# Altium project Flight Controller SoM.PrjPcb (part 1 of 2)
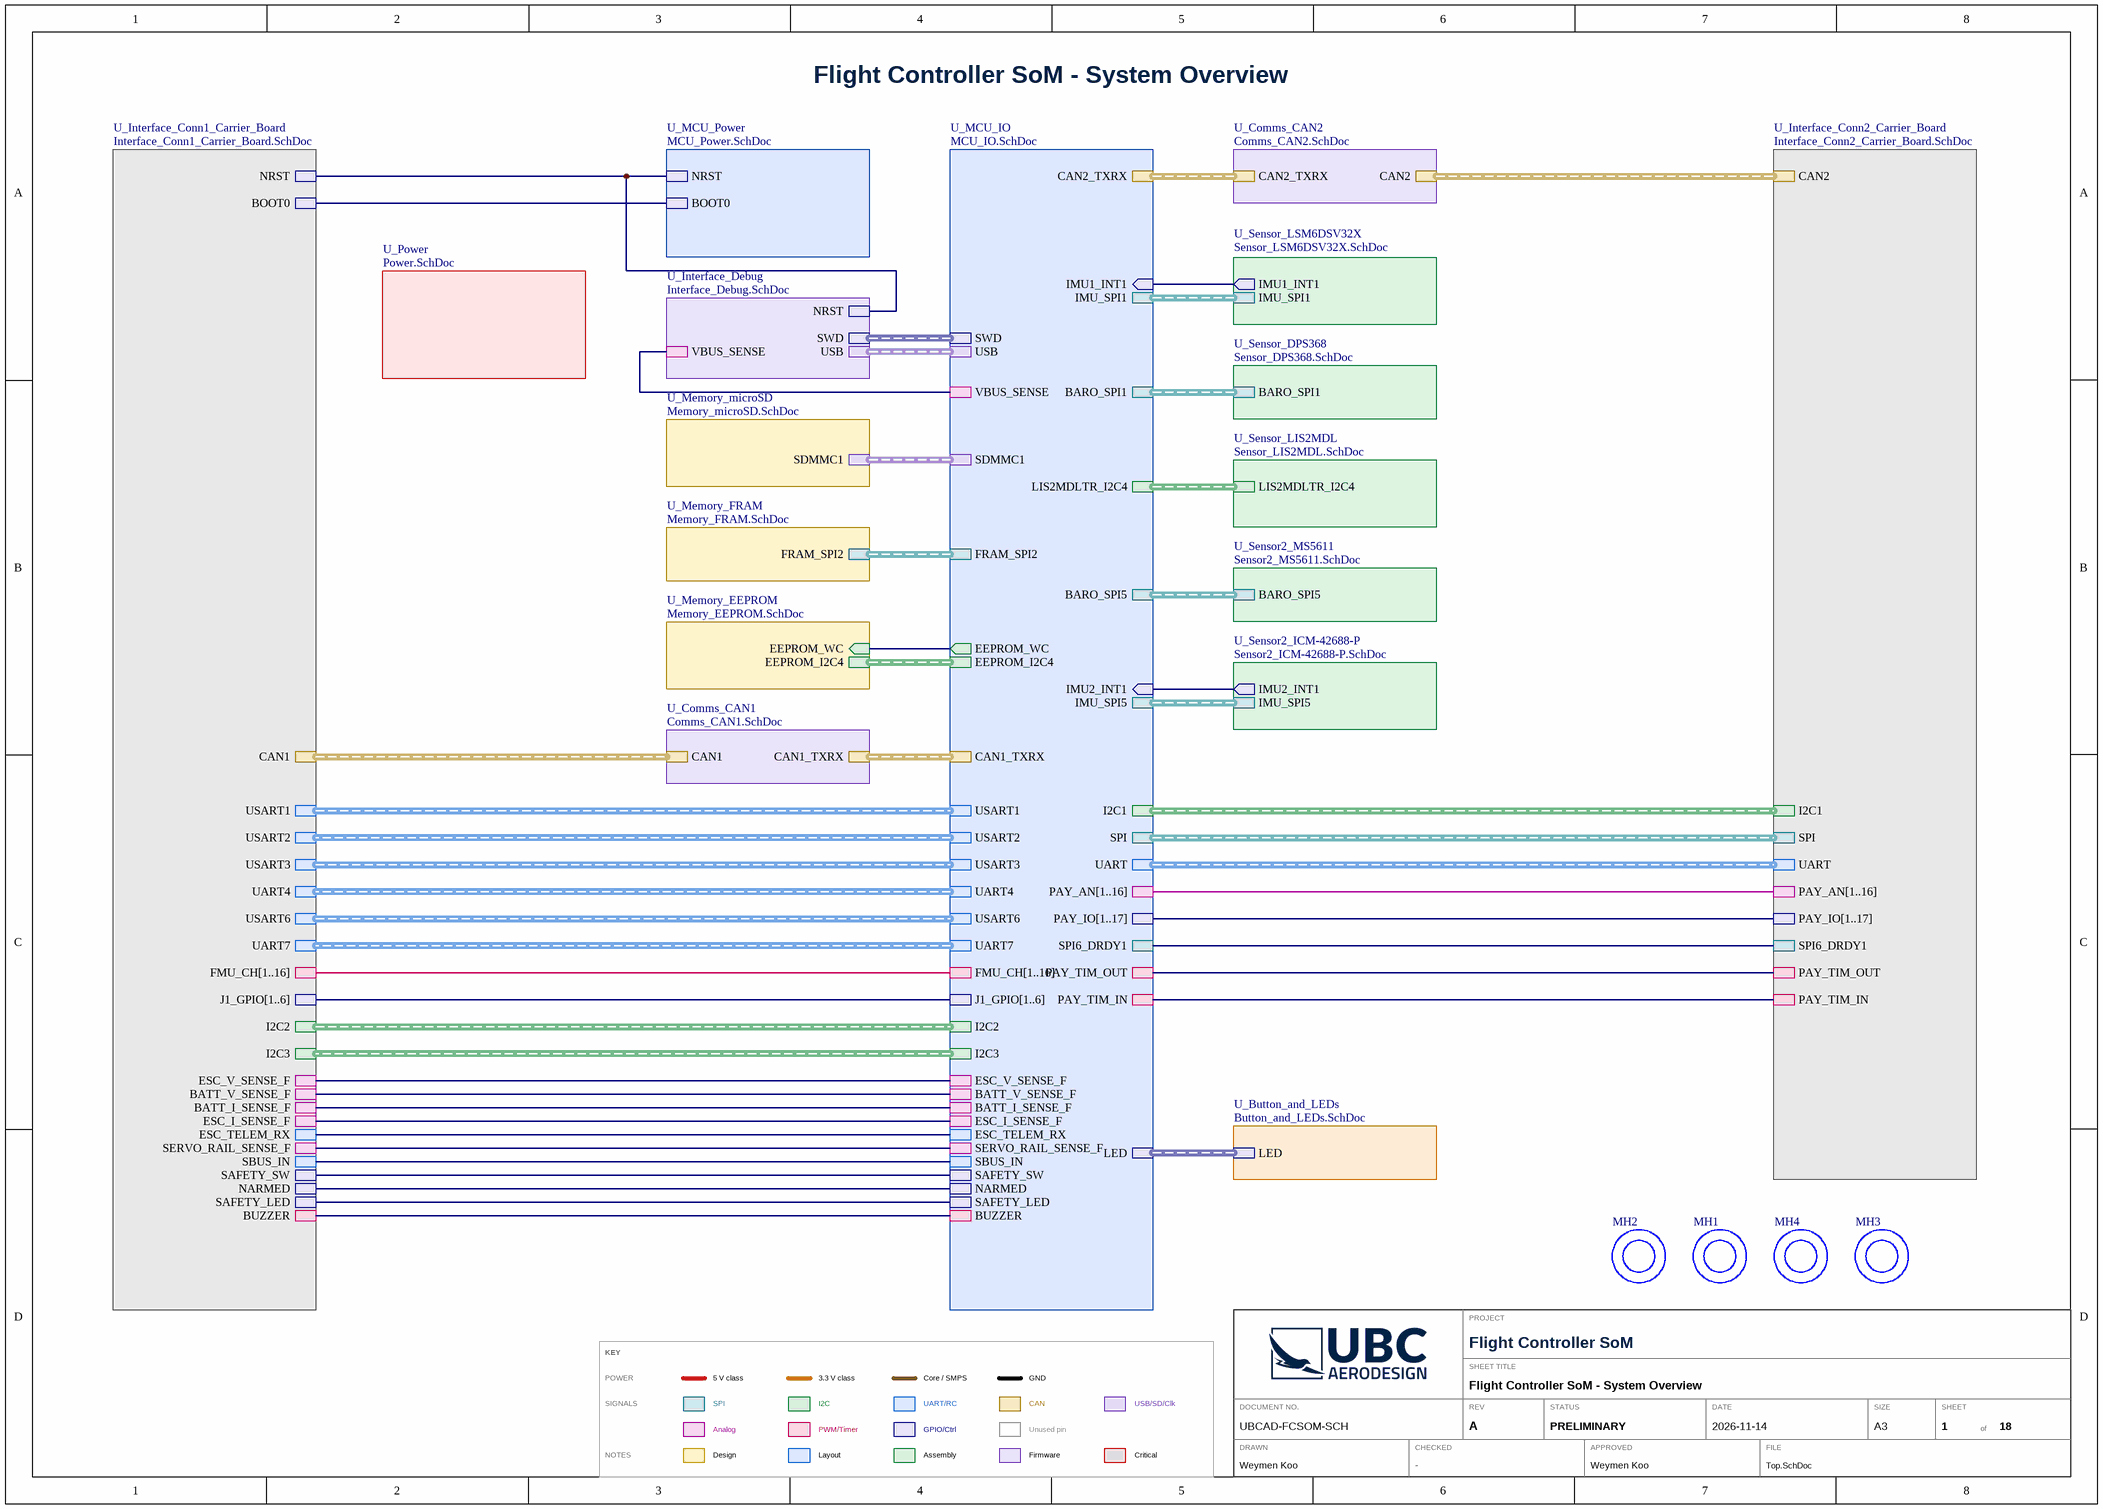
[diagram p0: Top.SchDoc]
18 sheets, 176 parts. Net scope: hierarchical (ports join the sheet entries above them; power ports are global).
Board file: Flight Controller SoM.PcbDoc
Sheets:
  Top.SchDoc
    U_MCU_Power = MCU_Power.SchDoc
    U_Memory_EEPROM = Memory_EEPROM.SchDoc
    U_Memory_FRAM = Memory_FRAM.SchDoc
    U_Memory_microSD = Memory_microSD.SchDoc
    U_Sensor_DPS368 = Sensor_DPS368.SchDoc
    U_Sensor_LSM6DSV32X = Sensor_LSM6DSV32X.SchDoc
    U_Sensor_LIS2MDL = Sensor_LIS2MDL.SchDoc
    U_Sensor2_MS5611 = Sensor2_MS5611.SchDoc
    U_Sensor2_ICM-42688-P = Sensor2_ICM-42688-P.SchDoc
    U_Button_and_LEDs = Button_and_LEDs.SchDoc
    U_Interface_Debug = Interface_Debug.SchDoc
    U_MCU_IO = MCU_IO.SchDoc
    U_Power = Power.SchDoc
    U_Interface_Conn1_Carrier_Board = Interface_Conn1_Carrier_Board.SchDoc
    U_Interface_Conn2_Carrier_Board = Interface_Conn2_Carrier_Board.SchDoc
    U_Comms_CAN1 = Comms_CAN1.SchDoc
    U_Comms_CAN2 = Comms_CAN2.SchDoc

## Sheet Top.SchDoc: Flight Controller SoM - System Overview
size A3; Date: 11/20/2026; ApprovedBy: Weymen Koo; CheckedBy: -; Author: Weymen Koo; CompanyName: UBC AeroDesign; DrawnBy: Weymen Koo; Organization: UBC AeroDesign; DocumentNumber: UBCAD-FCSOM-SCH; Revision: A; SheetNumber: 1; SheetTotal: 18; ProjectTitle: Flight Controller SoM; Status: PRELIMINARY; ReleaseDate: 2026-11-14; FC_IdxN01: 1; FC_IdxT01: System overview; FC_IdxN02: 2; FC_IdxT02: Power; FC_IdxN03: 3; FC_IdxT03: MCU power, clock, reset; FC_IdxN04: 4; FC_IdxT04: MCU I/O; FC_IdxN05: 5; FC_IdxT05: IMU 1 LSM6DSV32X; FC_IdxN06: 6; FC_IdxT06: Baro 1 DPS368; FC_IdxN07: 7; FC_IdxT07: IMU 2 ICM-42688-P; FC_IdxN08: 8; FC_IdxT08: Baro 2 MS5611; FC_IdxN09: 9; FC_IdxT09: Mag LIS2MDL; FC_IdxN10: 10; FC_IdxT10: FRAM; FC_IdxN11: 11; FC_IdxT11: EEPROM; FC_IdxN12: 12; FC_IdxT12: microSD; FC_IdxN13: 13; FC_IdxT13: CAN FD 1; FC_IdxN14: 14; FC_IdxT14: CAN FD 2; FC_IdxN15: 15; FC_IdxT15: USB-C, SWD debug; FC_IdxN16: 16; FC_IdxT16: Status LEDs; FC_IdxN17: 17; FC_IdxT17: Carrier J4 flight I/O; FC_IdxN18: 18; FC_IdxT18: Carrier J5 payload I/O; FC_Rev1: A; FC_RevDate1: 2026-11-14; FC_RevDesc1: First release, JLCPCB fab and assembly; FC_RevBy1: Weymen Koo

### Parts
MH1  MH_M3_NPTH_3.2_MO6.0_KO6.5  [MH_M3_NPTH_7mmKO-Footprint-1]  (value not drawn)  (no BOM)
MH2  MH_M3_NPTH_3.2_MO6.0_KO6.5  [MH_M3_NPTH_7mmKO-Footprint-1]  (value not drawn)  (no BOM)
MH3  MH_M3_NPTH_3.2_MO6.0_KO6.5  [MH_M3_NPTH_7mmKO-Footprint-1]  (value not drawn)  (no BOM)
MH4  MH_M3_NPTH_3.2_MO6.0_KO6.5  [MH_M3_NPTH_7mmKO-Footprint-1]  (value not drawn)  (no BOM)

### Sub-sheets
U_Button_and_LEDs = Button_and_LEDs.SchDoc: LED (harness LED)
U_Comms_CAN1 = Comms_CAN1.SchDoc: CAN1 (harness CAN), CAN1_TXRX (harness TXD)
U_Comms_CAN2 = Comms_CAN2.SchDoc: CAN2 (harness CAN), CAN2_TXRX (harness TXD)
U_Interface_Conn1_Carrier_Board = Interface_Conn1_Carrier_Board.SchDoc: USART1 (harness UART), USART2 (harness UART), USART3 (harness UART), UART4 (harness UART), USART6 (harness UART), UART7 (harness UART), CAN1 (harness CAN), FMU_CH[1..16], J1_GPIO[1..6], ESC_I_SENSE_F, ESC_TELEM_RX, I2C2 (harness I2C), I2C3 (harness I2C), NRST, BATT_V_SENSE_F, BATT_I_SENSE_F, SERVO_RAIL_SENSE_F, SBUS_IN, SAFETY_SW, NARMED, SAFETY_LED, BUZZER, BOOT0, ESC_V_SENSE_F
U_Interface_Conn2_Carrier_Board = Interface_Conn2_Carrier_Board.SchDoc: CAN2 (harness CAN), UART (harness UART), SPI (harness SPI), I2C1 (harness I2C), SPI6_DRDY1, PAY_AN[1..16], PAY_IO[1..17], PAY_TIM_OUT, PAY_TIM_IN
U_Interface_Debug = Interface_Debug.SchDoc: USB (harness USB), SWD (harness SWD), NRST, VBUS_SENSE
U_MCU_IO = MCU_IO.SchDoc: USART1 (harness UART), USART2 (harness UART), USART3 (harness UART), UART4 (harness UART), USART6 (harness UART), UART7 (harness UART), CAN1_TXRX (harness TXD), EEPROM_I2C4 (harness I2C), EEPROM_WC (out), FRAM_SPI2 (harness SPI), SDMMC1 (harness SDMMC), IMU2_INT1 (in), IMU_SPI5 (harness SPI), IMU1_INT1 (in), IMU_SPI1 (harness SPI), CAN2_TXRX (harness TXD), BARO_SPI5 (harness SPI), BARO_SPI1 (harness SPI), I2C1 (harness I2C), SPI (harness SPI), UART (harness UART), SPI6_DRDY1, FMU_CH[1..16], J1_GPIO[1..6], PAY_AN[1..16], PAY_IO[1..17], USB (harness USB), SWD (harness SWD), ESC_I_SENSE_F, ESC_TELEM_RX, I2C2 (harness I2C), I2C3 (harness I2C), BATT_V_SENSE_F, BATT_I_SENSE_F, SERVO_RAIL_SENSE_F, SBUS_IN, SAFETY_SW, NARMED, SAFETY_LED, BUZZER, PAY_TIM_OUT, PAY_TIM_IN, ESC_V_SENSE_F, LIS2MDLTR_I2C4 (harness I2C), VBUS_SENSE, LED (harness LED)
U_MCU_Power = MCU_Power.SchDoc: NRST, BOOT0
U_Memory_EEPROM = Memory_EEPROM.SchDoc: EEPROM_WC (in), EEPROM_I2C4 (harness I2C)
U_Memory_FRAM = Memory_FRAM.SchDoc: FRAM_SPI2 (harness SPI)
U_Memory_microSD = Memory_microSD.SchDoc: SDMMC1 (harness SDMMC)
U_Power = Power.SchDoc: no entries
U_Sensor2_ICM-42688-P = Sensor2_ICM-42688-P.SchDoc: IMU2_INT1 (out), IMU_SPI5 (harness SPI)
U_Sensor2_MS5611 = Sensor2_MS5611.SchDoc: BARO_SPI5 (harness SPI)
U_Sensor_DPS368 = Sensor_DPS368.SchDoc: BARO_SPI1 (harness SPI)
U_Sensor_LIS2MDL = Sensor_LIS2MDL.SchDoc: LIS2MDLTR_I2C4 (harness I2C)
U_Sensor_LSM6DSV32X = Sensor_LSM6DSV32X.SchDoc: IMU1_INT1 (out), IMU_SPI1 (harness SPI)

### Nets
BATT_I_SENSE_F: sheet U_MCU_IO/BATT_I_SENSE_F, sheet U_Interface_Conn1_Carrier_Board/BATT_I_SENSE_F
BATT_V_SENSE_F: sheet U_MCU_IO/BATT_V_SENSE_F, sheet U_Interface_Conn1_Carrier_Board/BATT_V_SENSE_F
BOOT0: sheet U_MCU_Power/BOOT0, sheet U_Interface_Conn1_Carrier_Board/BOOT0
BUZZER: sheet U_MCU_IO/BUZZER, sheet U_Interface_Conn1_Carrier_Board/BUZZER
EEPROM_WC: sheet U_Memory_EEPROM/EEPROM_WC, sheet U_MCU_IO/EEPROM_WC
ESC_I_SENSE_F: sheet U_MCU_IO/ESC_I_SENSE_F, sheet U_Interface_Conn1_Carrier_Board/ESC_I_SENSE_F
ESC_TELEM_RX: sheet U_MCU_IO/ESC_TELEM_RX, sheet U_Interface_Conn1_Carrier_Board/ESC_TELEM_RX
ESC_V_SENSE_F: sheet U_MCU_IO/ESC_V_SENSE_F, sheet U_Interface_Conn1_Carrier_Board/ESC_V_SENSE_F
IMU1_INT1: sheet U_Sensor_LSM6DSV32X/IMU1_INT1, sheet U_MCU_IO/IMU1_INT1
IMU2_INT1: sheet U_Sensor2_ICM-42688-P/IMU2_INT1, sheet U_MCU_IO/IMU2_INT1
NARMED: sheet U_MCU_IO/NARMED, sheet U_Interface_Conn1_Carrier_Board/NARMED
NRST: sheet U_MCU_Power/NRST, sheet U_Interface_Debug/NRST, sheet U_Interface_Conn1_Carrier_Board/NRST
PAY_TIM_IN: sheet U_MCU_IO/PAY_TIM_IN, sheet U_Interface_Conn2_Carrier_Board/PAY_TIM_IN
PAY_TIM_OUT: sheet U_MCU_IO/PAY_TIM_OUT, sheet U_Interface_Conn2_Carrier_Board/PAY_TIM_OUT
SAFETY_LED: sheet U_MCU_IO/SAFETY_LED, sheet U_Interface_Conn1_Carrier_Board/SAFETY_LED
SAFETY_SW: sheet U_MCU_IO/SAFETY_SW, sheet U_Interface_Conn1_Carrier_Board/SAFETY_SW
SBUS_IN: sheet U_MCU_IO/SBUS_IN, sheet U_Interface_Conn1_Carrier_Board/SBUS_IN
SERVO_RAIL_SENSE_F: sheet U_MCU_IO/SERVO_RAIL_SENSE_F, sheet U_Interface_Conn1_Carrier_Board/SERVO_RAIL_SENSE_F
SPI6_DRDY1: sheet U_MCU_IO/SPI6_DRDY1, sheet U_Interface_Conn2_Carrier_Board/SPI6_DRDY1
VBUS_SENSE: sheet U_Interface_Debug/VBUS_SENSE, sheet U_MCU_IO/VBUS_SENSE

### Buses and harness runs
bus sheet U_Interface_Conn1_Carrier_Board/FMU_CH[1..16] = sheet U_MCU_IO/FMU_CH[1..16]
bus sheet U_Interface_Conn1_Carrier_Board/J1_GPIO[1..6] = sheet U_MCU_IO/J1_GPIO[1..6]
bus sheet U_Interface_Conn2_Carrier_Board/PAY_AN[1..16] = sheet U_MCU_IO/PAY_AN[1..16]
bus sheet U_Interface_Conn2_Carrier_Board/PAY_IO[1..17] = sheet U_MCU_IO/PAY_IO[1..17]
harness sheet U_Button_and_LEDs/LED = sheet U_MCU_IO/LED
harness sheet U_Comms_CAN1/CAN1 = sheet U_Interface_Conn1_Carrier_Board/CAN1
harness sheet U_Comms_CAN1/CAN1_TXRX = sheet U_MCU_IO/CAN1_TXRX
harness sheet U_Comms_CAN2/CAN2 = sheet U_Interface_Conn2_Carrier_Board/CAN2
harness sheet U_Comms_CAN2/CAN2_TXRX = sheet U_MCU_IO/CAN2_TXRX
harness sheet U_Interface_Conn1_Carrier_Board/I2C2 = sheet U_MCU_IO/I2C2
harness sheet U_Interface_Conn1_Carrier_Board/I2C3 = sheet U_MCU_IO/I2C3
harness sheet U_Interface_Conn1_Carrier_Board/UART4 = sheet U_MCU_IO/UART4
harness sheet U_Interface_Conn1_Carrier_Board/UART7 = sheet U_MCU_IO/UART7
harness sheet U_Interface_Conn1_Carrier_Board/USART1 = sheet U_MCU_IO/USART1
harness sheet U_Interface_Conn1_Carrier_Board/USART2 = sheet U_MCU_IO/USART2
harness sheet U_Interface_Conn1_Carrier_Board/USART3 = sheet U_MCU_IO/USART3
harness sheet U_Interface_Conn1_Carrier_Board/USART6 = sheet U_MCU_IO/USART6
harness sheet U_Interface_Conn2_Carrier_Board/I2C1 = sheet U_MCU_IO/I2C1
harness sheet U_Interface_Conn2_Carrier_Board/SPI = sheet U_MCU_IO/SPI
harness sheet U_Interface_Conn2_Carrier_Board/UART = sheet U_MCU_IO/UART
harness sheet U_Interface_Debug/SWD = sheet U_MCU_IO/SWD
harness sheet U_Interface_Debug/USB = sheet U_MCU_IO/USB
harness sheet U_MCU_IO/BARO_SPI1 = sheet U_Sensor_DPS368/BARO_SPI1
harness sheet U_MCU_IO/BARO_SPI5 = sheet U_Sensor2_MS5611/BARO_SPI5
harness sheet U_MCU_IO/EEPROM_I2C4 = sheet U_Memory_EEPROM/EEPROM_I2C4
harness sheet U_MCU_IO/FRAM_SPI2 = sheet U_Memory_FRAM/FRAM_SPI2
harness sheet U_MCU_IO/IMU_SPI1 = sheet U_Sensor_LSM6DSV32X/IMU_SPI1
harness sheet U_MCU_IO/IMU_SPI5 = sheet U_Sensor2_ICM-42688-P/IMU_SPI5
harness sheet U_MCU_IO/LIS2MDLTR_I2C4 = sheet U_Sensor_LIS2MDL/LIS2MDLTR_I2C4
harness sheet U_MCU_IO/SDMMC1 = sheet U_Memory_microSD/SDMMC1

### Notes on the sheet
- PROJECT
- KEY
- POWER
- 5 V class
- 3.3 V class
- Core / SMPS
- GND
- SHEET TITLE
- SIGNALS
- NOTES
- SPI
- Analog
- Design
- I2C
- PWM/Timer
- Layout
- UART/RC
- GPIO/Ctrl
- Assembly
- CAN
- Unused pin
- Firmware
- USB/SD/Clk
- Critical
- DRAWN
- DOCUMENT NO.
- CHECKED
- REV
- STATUS
- APPROVED
- DATE
- FILE
- SIZE
- A3
- SHEET
- of

### Library data of the parts
MH1-MH4 = CMP-00043-8: Mounting hole, M3, non-plated, Ø3.2 mm finished hole, Ø6.0 mm solder mask opening (bare FR-4), Ø6.2 mm copper keepout all layers, electrically isolated

## Sheet MCU_Power.SchDoc: MCU - Power, SMPS, Clock, Reset, Boot
size A3; ApprovedBy: Weymen Koo; CheckedBy: -; DrawnBy: Weymen Koo; DocumentNumber: UBCAD-FCSOM-SCH; Revision: A; SheetNumber: 4; SheetTotal: 18; ProjectTitle: Flight Controller SoM; Status: PRELIMINARY; ReleaseDate: 2026-11-14
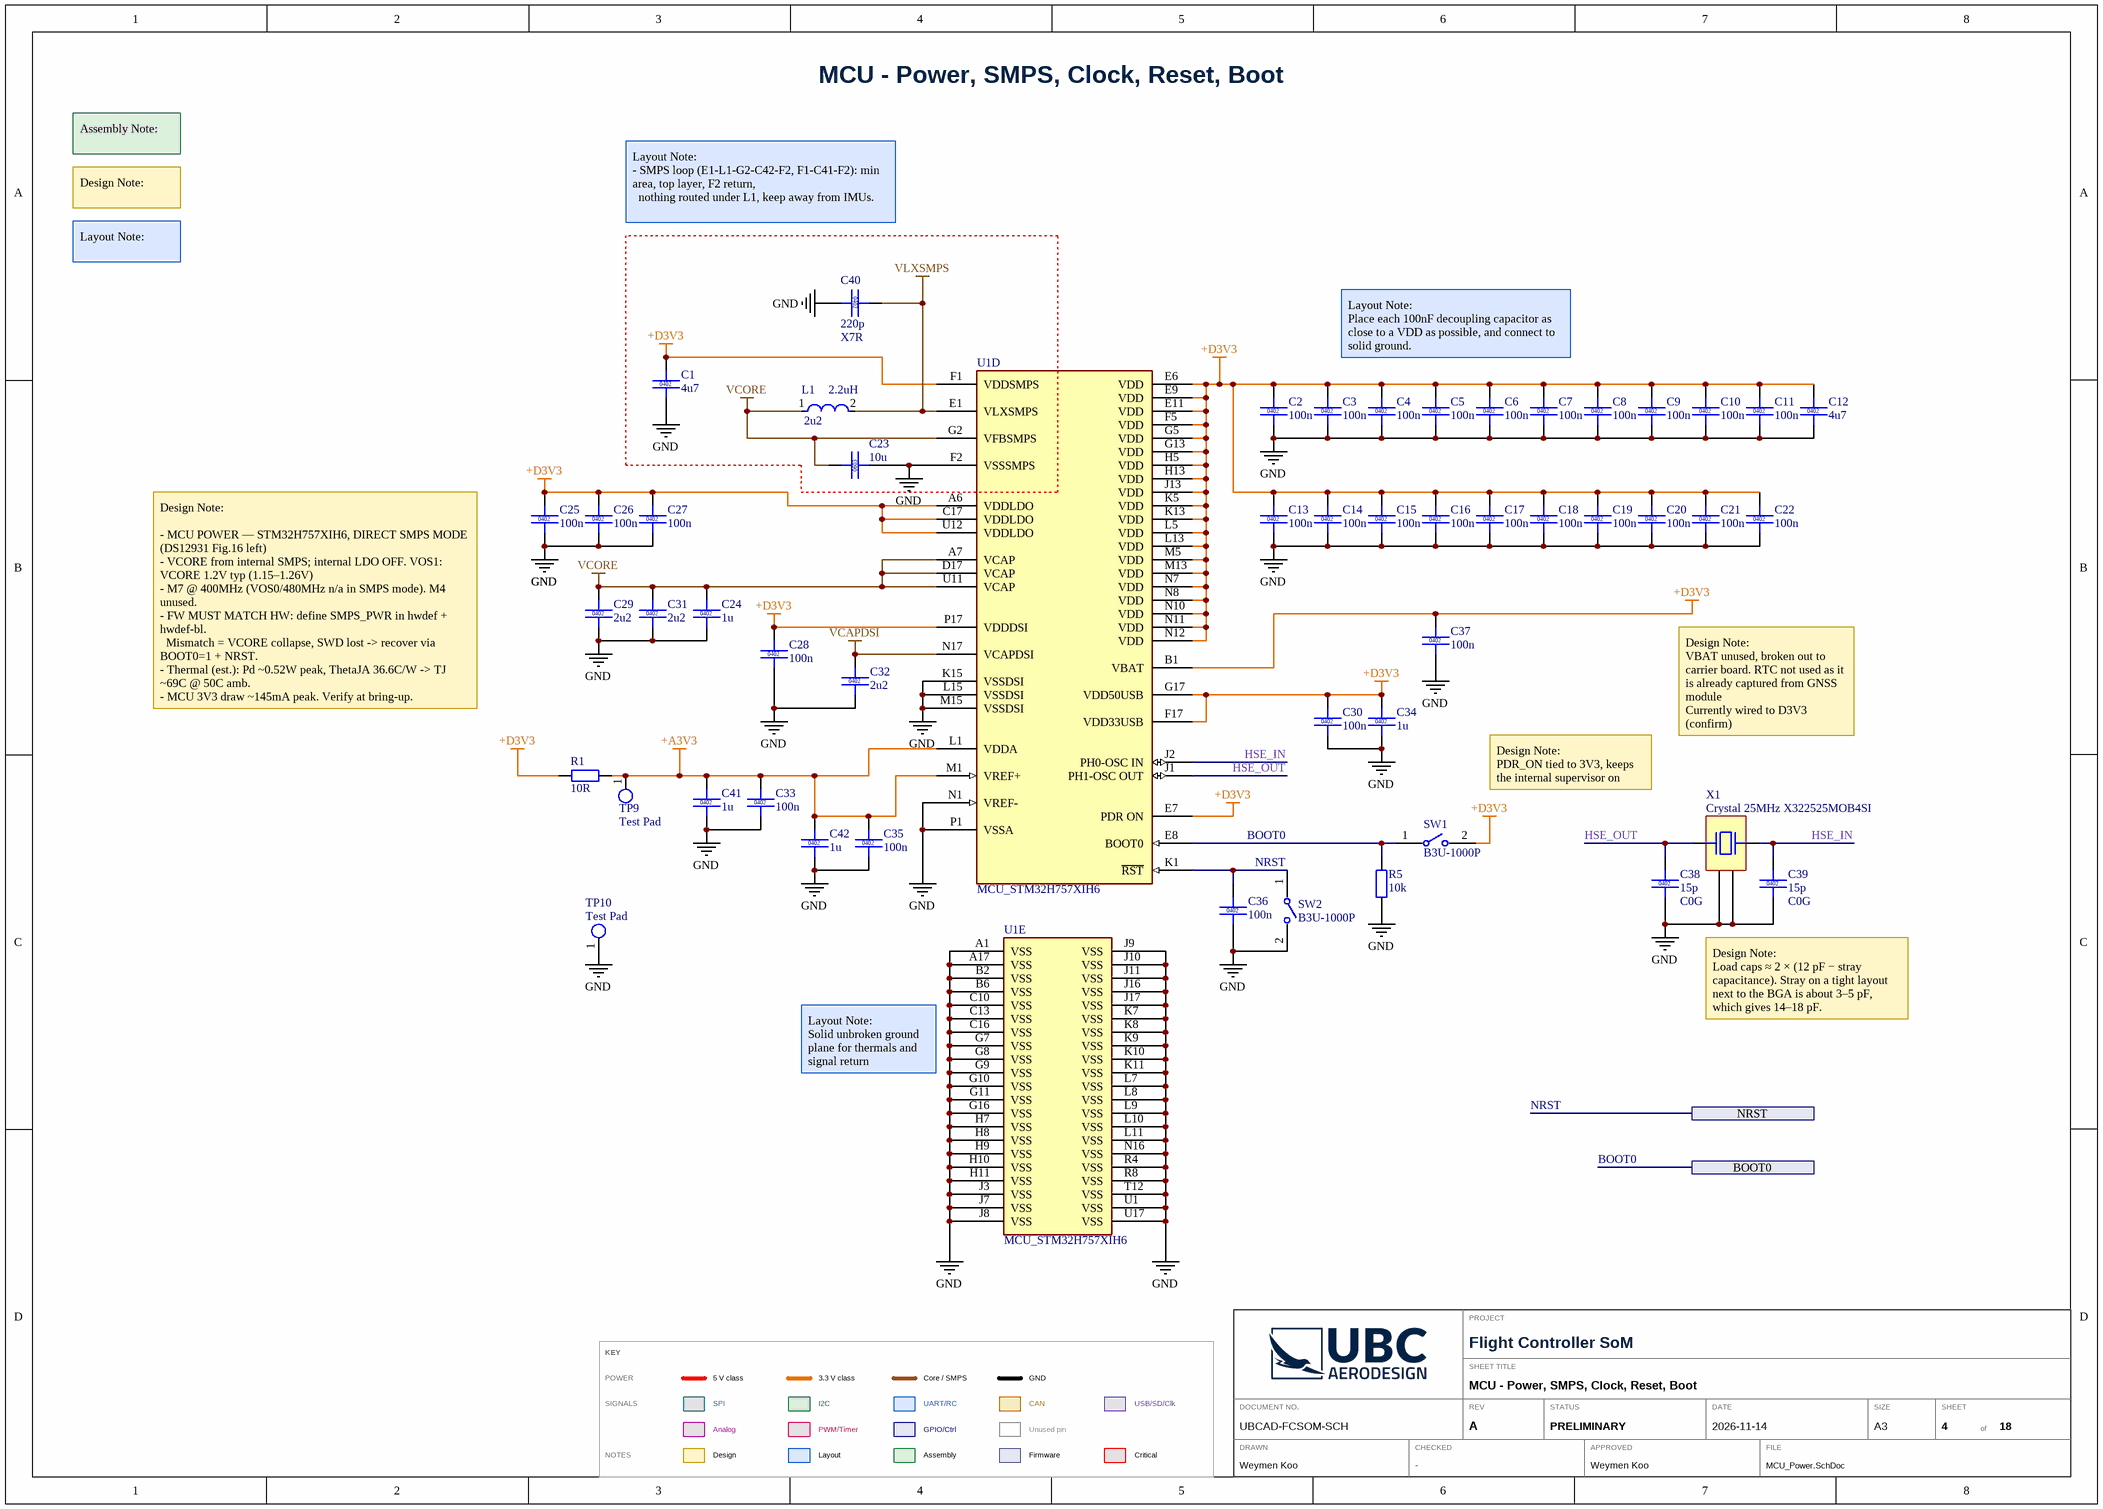
[diagram p1: MCU_Power.SchDoc]

### Parts
C1  4u7  [CAPC1005X05N]
C2  100n  [CAPC1005X05N]
C3  100n  [CAPC1005X05N]
C4  100n  [CAPC1005X05N]
C5  100n  [CAPC1005X05N]
C6  100n  [CAPC1005X05N]
C7  100n  [CAPC1005X05N]
C8  100n  [CAPC1005X05N]
C9  100n  [CAPC1005X05N]
C10  100n  [CAPC1005X05N]
C11  100n  [CAPC1005X05N]
C12  4u7  [CAPC1005X05N]
C13  100n  [CAPC1005X05N]
C14  100n  [CAPC1005X05N]
C15  100n  [CAPC1005X05N]
C16  100n  [CAPC1005X05N]
C17  100n  [CAPC1005X05N]
C18  100n  [CAPC1005X05N]
C19  100n  [CAPC1005X05N]
C20  100n  [CAPC1005X05N]
C21  100n  [CAPC1005X05N]
C22  100n  [CAPC1005X05N]
C23  10u  [CAPC1608X08N]
C24  1u  [CAPC1005X05N]
C25  100n  [CAPC1005X05N]
C26  100n  [CAPC1005X05N]
C27  100n  [CAPC1005X05N]
C28  100n  [CAPC1005X05N]
C29  2u2  [CAPC1005X05N]
C30  100n  [CAPC1005X05N]
C31  2u2  [CAPC1005X05N]
C32  2u2  [CAPC1005X05N]
C33  100n  [CAPC1005X05N]
C34  1u  [CAPC1005X05N]
C35  100n  [CAPC1005X05N]
C36  100n  [CAPC1005X05N]
C37  100n  [CAPC1005X05N]
C38  15p  Temperature Coefficient: C0G  [CAPC1005X05N]
C39  15p  Temperature Coefficient: C0G  [CAPC1005X05N]
C40  220p  Temperature Coefficient: X7R  [CAPC1005X05N]
C41  1u  [CAPC1005X05N]
C42  1u  [CAPC1005X05N]
L1  2u2  Inductance: 2.2uH  [FP-DFE252012C-IPC_B]
R1  10R  [IPC C R0402 NO SILK]
R5  10k  [IPC C R0402 NO SILK]
SW1  B3U-1000P  [FP-B3U-1000P-MFG]
SW2  B3U-1000P  [FP-B3U-1000P-MFG]
TP9  Test Pad  [PCBComponent_1]
TP10  Test Pad  [PCBComponent_1]
U1  MCU_STM32H757XIH6  [FP-TFBGA2650-A07U-MFG]  (parts D,E of 5)
X1  Crystal 25MHz X322525MOB4SI  [OSC-SMD_4P-L3.2-W2.5-BL]

### Ports
BOOT0 (see 1[3A], 18[5A]), NRST (see 1[3A], 16[6C], 18[5A])

### Nets
+A3V3: C33.1 C35.1 C41.1 C42.1 R1.1 TP9.1 U1.L1(VDDA) U1.M1(VREF+)
+D3V3: C1.1 C2.1 C3.1 C4.1 C5.1 C6.1 C7.1 C8.1 C9.1 C10.1 C11.1 C12.1 C13.1 C14.1 C15.1 C16.1 C17.1 C18.1 C19.1 C20.1 C21.1 C22.1 C25.1 C26.1 C27.1 C28.1 C30.1 C34.1 C37.1 R1.2 SW1.2 U1.A6(VDDLDO) U1.B1(VBAT) U1.C17(VDDLDO) U1.E6(VDD) U1.E7(PDR_ON) U1.E9(VDD) U1.E11(VDD) U1.F1(VDDSMPS) U1.F5(VDD) U1.F17(VDD33USB) U1.G5(VDD) U1.G13(VDD) U1.G17(VDD50USB) U1.H5(VDD) U1.H13(VDD) U1.J13(VDD) U1.K5(VDD) U1.K13(VDD) U1.L5(VDD) U1.L13(VDD) U1.M5(VDD) U1.M13(VDD) U1.N7(VDD) U1.N8(VDD) U1.N10(VDD) U1.N11(VDD) U1.N12(VDD) U1.P17(VDDDSI) U1.U12(VDDLDO)
GND: C1.2 C2.2 C3.2 C4.2 C5.2 C6.2 C7.2 C8.2 C9.2 C10.2 C11.2 C12.2 C13.2 C14.2 C15.2 C16.2 C17.2 C18.2 C19.2 C20.2 C21.2 C22.2 C23.2 C24.2 C25.2 C26.2 C27.2 C28.2 C29.2 C30.2 C31.2 C32.2 C33.2 C34.2 C35.2 C36.2 C37.2 C38.2 C39.2 C40.1 C41.2 C42.2 R5.1 SW2.2 TP10.1 U1.A1(VSS) U1.A17(VSS) U1.B2(VSS) U1.B6(VSS) U1.C10(VSS) U1.C13(VSS) U1.C16(VSS) U1.F2(VSSSMPS) U1.G7(VSS) U1.G8(VSS) U1.G9(VSS) U1.G10(VSS) U1.G11(VSS) U1.G16(VSS) U1.H7(VSS) U1.H8(VSS) U1.H9(VSS) U1.H10(VSS) U1.H11(VSS) U1.J3(VSS) U1.J7(VSS) U1.J8(VSS) U1.J9(VSS) U1.J10(VSS) U1.J11(VSS) U1.J16(VSS) U1.J17(VSS) U1.K7(VSS) U1.K8(VSS) U1.K9(VSS) U1.K10(VSS) U1.K11(VSS) U1.K15(VSSDSI) U1.L7(VSS) U1.L8(VSS) U1.L9(VSS) U1.L10(VSS) U1.L11(VSS) U1.L15(VSSDSI) U1.M15(VSSDSI) U1.N1(VREF-) U1.N16(VSS) U1.P1(VSSA) U1.R4(VSS) U1.R8(VSS) U1.T12(VSS) U1.U1(VSS) U1.U17(VSS) X1.2 X1.4
VCAPDSI: C32.1 U1.N17(VCAPDSI)
VCORE: C23.1 C24.1 C29.1 C31.1 L1.1 U1.A7(VCAP) U1.D17(VCAP) U1.G2(VFBSMPS) U1.U11(VCAP)
VLXSMPS: C40.2 L1.2 U1.E1(VLXSMPS)
BOOT0: R5.2 SW1.1 U1.E8(BOOT0) ; port BOOT0
HSE_IN: C39.1 U1.J2(PH0-OSC_IN) X1.3
HSE_OUT: C38.1 U1.J1(PH1-OSC_OUT) X1.1
NRST: C36.1 SW2.1 U1.K1(~{RST}) ; port NRST

### Notes on the sheet
- Assembly Note:
- Design Note:
- Layout Note:
  - SMPS loop (E1-L1-G2-C42-F2, F1-C41-F2): min area, top layer, F2 return,
  nothing routed under L1, keep away from IMUs.
- Layout Note:
- Layout Note:
  Place each 100nF decoupling capacitor as close to a VDD as possible, and connect to solid ground.
- Design Note:
  - MCU POWER — STM32H757XIH6, DIRECT SMPS MODE (DS12931 Fig.16 left)
  - VCORE from internal SMPS; internal LDO OFF. VOS1: VCORE 1.2V typ (1.15–1.26V)
  - M7 @ 400MHz (VOS0/480MHz n/a in SMPS mode). M4 unused.
  - FW MUST MATCH HW: define SMPS_PWR in hwdef + hwdef-bl.
  Mismatch = VCORE collapse, SWD lost -> recover via BOOT0=1 + NRST.
  - Thermal (est.): Pd ~0.52W peak, ThetaJA 36.6C/W -> TJ ~69C @ 50C amb.
  - MCU 3V3 draw ~145mA peak. Verify at bring-up.
- Design Note:
  PDR_ON tied to 3V3, keeps the internal supervisor on
- Design Note:
  VBAT unused, broken out to carrier board. RTC not used as it is already captured from GNSS module
  Currently wired to D3V3 (confirm)
- Design Note:
  Load caps ≈ 2 × (12 pF − stray capacitance). Stray on a tight layout next to the BGA is about 3–5 pF, which gives 14–18 pF.
- Layout Note:
  Solid unbroken ground plane for thermals and signal return
- PROJECT
- KEY
- POWER
- 5 V class
- 3.3 V class
- Core / SMPS
- GND
- SHEET TITLE
- SIGNALS
- NOTES
- SPI
- Analog
- Design
- I2C
- PWM/Timer
- Layout
- UART/RC
- GPIO/Ctrl
- Assembly
- CAN
- Unused pin
- Firmware
- USB/SD/Clk
- Critical
- DRAWN
- DOCUMENT NO.
- CHECKED
- REV
- STATUS
- APPROVED
- DATE
- FILE
- SIZE
- A3
- SHEET
- of

### Library data of the parts
C1 C12 = CMP-002-000094-5: CAP 4u7 10V X5R 20% 0402; Manufacturer: Samsung; Manufacturer Part Number: CL05A475MP5NRNC; Value: 4u7; Tolerance: 20%; Package: 0402; Voltage: 10V; Dielectric: X5R; LCSC Part #: C23733
C2-C11 C13-C22 C25-C28 C30 C33 C35-C37 = CMP-002-000094-5: CAP 100n 16V X7R 10% 0402; Manufacturer: Samsung; Manufacturer Part Number: CL05B104KO5NNNC; Value: 100n; Tolerance: 10%; Package: 0402; Voltage: 16V; Dielectric: X7R; LCSC Part #: C1525
C23 = CMP-002-000095-4: CAP 10u 10V X5R 10% 0603; Manufacturer: Samsung; Manufacturer Part Number: CL10A106KP8NNNC; Value: 10u; Tolerance: 10%; Package: 0603; Voltage: 10V; Dielectric: X5R; LCSC Part #: C19702
C24 C34 C41 C42 = CMP-002-000094-5: CAP 1u 25V X5R 10% 0402; Manufacturer: Samsung; Manufacturer Part Number: CL05A105KA5NQNC; Value: 1u; Tolerance: 10%; Package: 0402; Voltage: 25V; Dielectric: X5R; LCSC Part #: C52923
C29 C31 C32 = CMP-002-000094-5: CAP 2u2 6.3V X5R 20% 0402; Manufacturer: Samsung; Manufacturer Part Number: CL05A225MQ5NSNC; Value: 2u2; Tolerance: 20%; Package: 0402; Voltage: 6.3V; Dielectric: X5R; LCSC Part #: C12530
C38 C39 = CMP-002-000094-5: CAP 15p 50V C0G 5% 0402; Manufacturer: FH; Manufacturer Part Number: 0402CG150J500NT; Value: 15p; Tolerance: 5%; Package: 0402; Voltage: 50V; Dielectric: C0G; LCSC Part #: C1548
C40 = CMP-002-000094-5: CAP 220p 50V X7R 10% 0402; Manufacturer: FH; Manufacturer Part Number: 0402B221K500NT; Value: 220p; Tolerance: 10%; Package: 0402; Voltage: 50V; Dielectric: X7R; LCSC Part #: C1530
L1 = CMP-06042-014676-1: Shielded Wirewound Inductor 2.2uH 20% 2300mA 0.082Ω 1008 (2520); Manufacturer: Murata; Manufacturer Part Number: DFE252012F-2R2M=P2; DC Resistance (DCR): 82mR; Test Frequency: 1MHz; Saturation Current: 3.6A; Core Material: Ferrite; Current Rating: 2.3A; Case/Package: 1008; Tolerance: 20%; Max Operating Temperature: 125°C; Shielding: Shielded; Height - Seated (Max): 0.047inch; Packaging: Tape and Reel; Min Operating Temperature: -40°C; Length: 0.098inch; Width: 0.079inch; Case Code (Imperial): 1008; Mount: Surface Mount; Case Code (Metric): 2520; Value: 2u2; Package: 2520
R1 = CMP-008-000000-2: RES 10R 1% 1/16W 0402; Manufacturer: UNI-ROYAL; Manufacturer Part Number: 0402WGF100JTCE; Value: 10R; Source: Schlib1.SchLib; Design Item ID: Generic RES 0402; Package: 0402; Tolerance: 1%; Power: 1/16W; LCSC Part #: C25077
R5 = CMP-008-000000-2: RES 10k 1% 1/16W 0402; Manufacturer: UNI-ROYAL; Manufacturer Part Number: 0402WGF1002TCE; Value: 10k; Source: Schlib1.SchLib; Design Item ID: Generic RES 0402; Package: 0402; Tolerance: 1%; Power: 1/16W; LCSC Part #: C25744
SW1 SW2 = CMP-2100-03586-2: SWITCH TACTILE SPST-NO 0.05A 12V; Contact Resistance: 100mR; Operating Force: 1.5N; Max Current Rating: 50mA; Switch Travel: 0.15mm; Actuator Type: Standard; Mechanical Life: 200000Cycles; Ratings: Dust Proof; Illumination Type: Non-Illuminated; Throw Configuration: SPST; Actuator Length: 0.4mm; Switch Function: Off-Mom; Height: 1.2mm; Width: 3mm; Weight: 0.000776oz; Contact Material: Silver; Max Voltage Rating (DC): 12V; Insulation Resistance: 100MR; Lead Free: Lead Free; Current Rating: 50mA; Termination: SMD/SMT; Length: 4mm; Voltage Rating (DC): 12V; Contact Current Rating: 50mA; Orientation: Straight; Depth: 2.5mm; Max Operating Temperature: 70°C; Packaging: Tape and Reel; Min Operating Temperature: -25°C; Package Quantity: 1; Mount: Surface Mount; Electrical Life: 200000Cycles
TP9 TP10 = CMP-092-000000-4: Design Item ID: TP; Source: Testpoint.SchLib
U1 = CMP-029-000010-1: MCU 32-bit ARM Cortex M7/M4 RISC 2MB Flash 3.3V 265-Pin TFBGA Tray; Component Type: Standard; Design Item ID: MCU_STM32H757XIH6; Pin Count: 265; Source: CRLS Lib.SchLib
X1 = CMP-004-000000-2: Crystal, 25 MHz, 10 ppm, 3225; Manufacturer: YXC(扬兴晶振); Add into BOM: yes; Frequency Tolerance: ±10ppm; Crystal Type: SMD Crystal Resonator; Frequency Stability: ±30ppm; Value: 25MHz; Supplier Part: C9006; Manufacturer Part: X322525MOB4SI; Design Item ID: Crystal 25MHz X322525MOB4SI; Supplier Footprint: SMD3225-4P; Device: X322525MOB4SI; LCSC Part Name: 25MHz ±10ppm 12pF; Symbol: X322525MOB4SI; Source: Schlib1.SchLib; Datasheet: https://atta.szlcsc.com/upload/public/pdf/source/20210329/C112971_1F611BDC486E193C1706F6D8EB5AA189.pdf; Convert to PCB: yes; JLCPCB Part Class: Basic Part

## Sheet Memory_EEPROM.SchDoc: Memory - EEPROM M24C64 (I2C4)
size A3; ApprovedBy: Weymen Koo; CheckedBy: -; DrawnBy: Weymen Koo; DocumentNumber: UBCAD-FCSOM-SCH; Revision: A; SheetNumber: 11; SheetTotal: 18; ProjectTitle: Flight Controller SoM; Status: PRELIMINARY; ReleaseDate: 2026-11-14
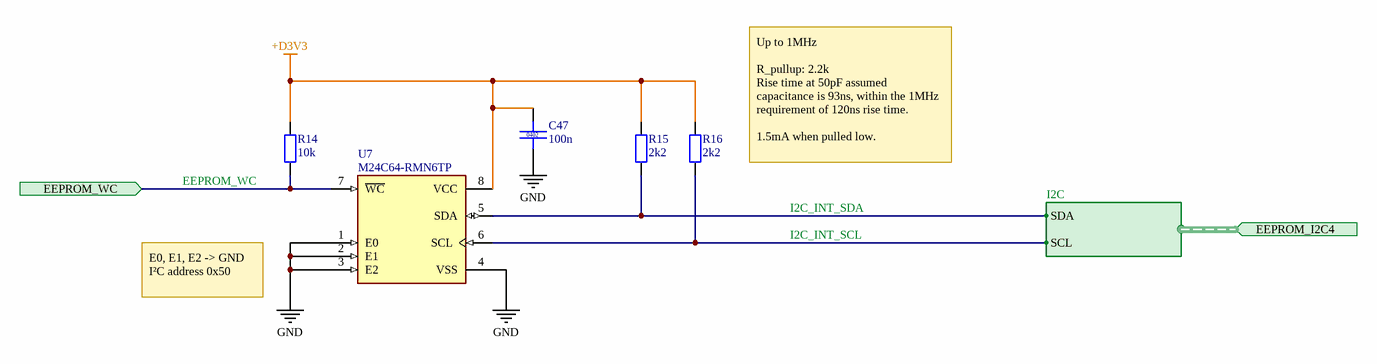
[diagram p2: Memory_EEPROM.SchDoc]

### Parts
C47  100n  [CAPC1005X05N]
R14  10k  [IPC C R0402 NO SILK]
R15  2k2  [IPC C R0402 NO SILK]
R16  2k2  [IPC C R0402 NO SILK]
U7  M24C64-RMN6TP  [SOIC127P600X175-8N]

### Ports
EEPROM_I2C4 (in, harness I2C, see 1[4B], 4[3B]), EEPROM_WC (in, see 1[4B], 4[3C])

### Harnesses
I2C: SCL, SDA

### Nets
+D3V3: C47.1 R14.2 R15.2 R16.2 U7.8(VCC)
GND: C47.2 U7.1(E0) U7.2(E1) U7.3(E2) U7.4(VSS)
EEPROM_WC: R14.1 U7.7(~{WC}) ; port EEPROM_WC
I2C_INT_SCL: R16.1 U7.6(SCL) ; port EEPROM_I2C4.SCL
I2C_INT_SDA: R15.1 U7.5(SDA) ; port EEPROM_I2C4.SDA

### Notes on the sheet
- Up to 1MHz
  R_pullup: 2.2k
  Rise time at 50pF assumed capacitance is 93ns, within the 1MHz requirement of 120ns rise time.
  1.5mA when pulled low.
- E0, E1, E2 -> GND
  I²C address 0x50
- PROJECT
- KEY
- POWER
- 5 V class
- 3.3 V class
- Core / SMPS
- GND
- SHEET TITLE
- SIGNALS
- NOTES
- SPI
- Analog
- Design
- I2C
- PWM/Timer
- Layout
- UART/RC
- GPIO/Ctrl
- Assembly
- CAN
- Unused pin
- Firmware
- USB/SD/Clk
- Critical
- DRAWN
- DOCUMENT NO.
- CHECKED
- REV
- STATUS
- APPROVED
- DATE
- FILE
- SIZE
- A3
- SHEET
- of

### Library data of the parts
C47 = CMP-002-000094-5: as C2 on sheet MCU_Power; Value: 100n; Tolerance: 10%; Package: 0402; Voltage: 16V; Dielectric: X7R; LCSC Part #: C1525
R14 = CMP-008-000000-2: as R5 on sheet MCU_Power; Value: 10k; Source: Schlib1.SchLib; Design Item ID: Generic RES 0402; Package: 0402; Tolerance: 1%; Power: 1/16W; LCSC Part #: C25744
R15 R16 = CMP-008-000000-2: RES 2k2 1% 1/16W 0402; Manufacturer: UNI-ROYAL; Manufacturer Part Number: 0402WGF2201TCE; Value: 2k2; Source: Schlib1.SchLib; Design Item ID: Generic RES 0402; Package: 0402; Tolerance: 1%; Power: 1/16W; LCSC Part #: C25879
U7 = CMP-057-000000-5: EEPROM Serial-I2C 64K-bit 8K x 8 2.5V/3.3V/5V 8-Pin SOIC T/R; MP: altium_native_batch; Availability: Unavailable; Pin Count: 8; Package: None; Component Type: Standard; Source: M24C64-RMN6TP.SchLib; Price: None; Design Item ID: M24C64-RMN6TP; Value: *

## Sheet Memory_FRAM.SchDoc: Memory - FRAM FM25V02A (SPI2)
size A3; ApprovedBy: Weymen Koo; CheckedBy: -; DrawnBy: Weymen Koo; DocumentNumber: UBCAD-FCSOM-SCH; Revision: A; SheetNumber: 10; SheetTotal: 18; ProjectTitle: Flight Controller SoM; Status: PRELIMINARY; ReleaseDate: 2026-11-14
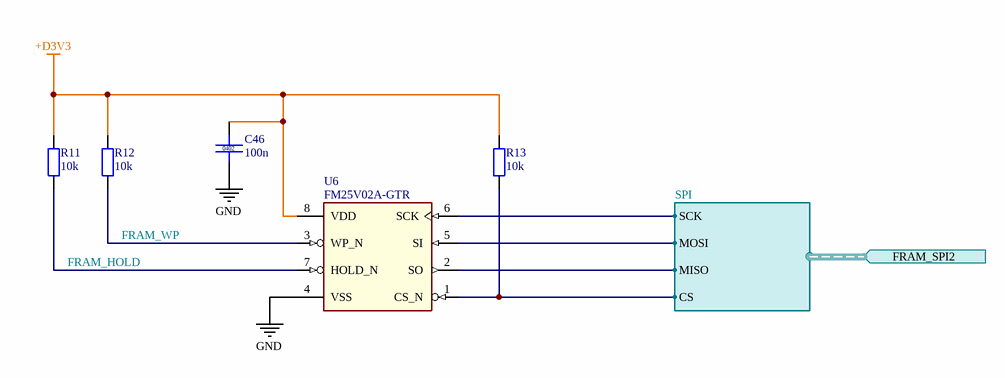
[diagram p3: Memory_FRAM.SchDoc]

### Parts
C46  100n  [CAPC1005X05N]
R11  10k  [IPC C R0402 NO SILK]
R12  10k  [IPC C R0402 NO SILK]
R13  10k  [IPC C R0402 NO SILK]
U6  FM25V02A-GTR  [SOIC127P602X173-8N-1-V]

### Ports
FRAM_SPI2 (in, harness SPI, see 1[4B], 4[2D])

### Harnesses
SPI: SCK, MOSI, MISO, CS

### Nets
+D3V3: C46.1 R11.2 R12.2 R13.2 U6.8(VDD)
GND: C46.2 U6.4(VSS)
FRAM_CS: R13.1 U6.1(CS_N) ; port FRAM_SPI2.CS
FRAM_HOLD: R11.1 U6.7(HOLD_N)
FRAM_WP: R12.1 U6.3(WP_N)
SPI2_MISO: U6.2(SO) ; port FRAM_SPI2.MISO
SPI2_MOSI: U6.5(SI) ; port FRAM_SPI2.MOSI
SPI2_SCK: U6.6(SCK) ; port FRAM_SPI2.SCK

### Notes on the sheet
- PROJECT
- KEY
- POWER
- 5 V class
- 3.3 V class
- Core / SMPS
- GND
- SHEET TITLE
- SIGNALS
- NOTES
- SPI
- Analog
- Design
- I2C
- PWM/Timer
- Layout
- UART/RC
- GPIO/Ctrl
- Assembly
- CAN
- Unused pin
- Firmware
- USB/SD/Clk
- Critical
- DRAWN
- DOCUMENT NO.
- CHECKED
- REV
- STATUS
- APPROVED
- DATE
- FILE
- SIZE
- A3
- SHEET
- of

### Library data of the parts
C46 = CMP-002-000094-5: as C2 on sheet MCU_Power; Value: 100n; Tolerance: 10%; Package: 0402; Voltage: 16V; Dielectric: X7R; LCSC Part #: C1525
R11-R13 = CMP-008-000000-2: as R5 on sheet MCU_Power; Value: 10k; Source: Schlib1.SchLib; Design Item ID: Generic RES 0402; Package: 0402; Tolerance: 1%; Power: 1/16W; LCSC Part #: C25744
U6 = CMP-029-000014-5: F-RAM, 256-Kbit (32K x 8), SPI, SOIC-8; Manufacturer: Infineon Technologies; Design Item ID: FM25V02A-GTR; PackageReference: PG-DSO-8-802; Source: FM25V02A-GTR.SchLib; Manufacturer Order Number: FM25V02A-GTR

## Sheet Memory_microSD.SchDoc: Memory - microSD Card (SDMMC1)
size A3; ApprovedBy: Weymen Koo; CheckedBy: -; DrawnBy: Weymen Koo; DocumentNumber: UBCAD-FCSOM-SCH; Revision: A; SheetNumber: 12; SheetTotal: 18; ProjectTitle: Flight Controller SoM; Status: PRELIMINARY; ReleaseDate: 2026-11-14
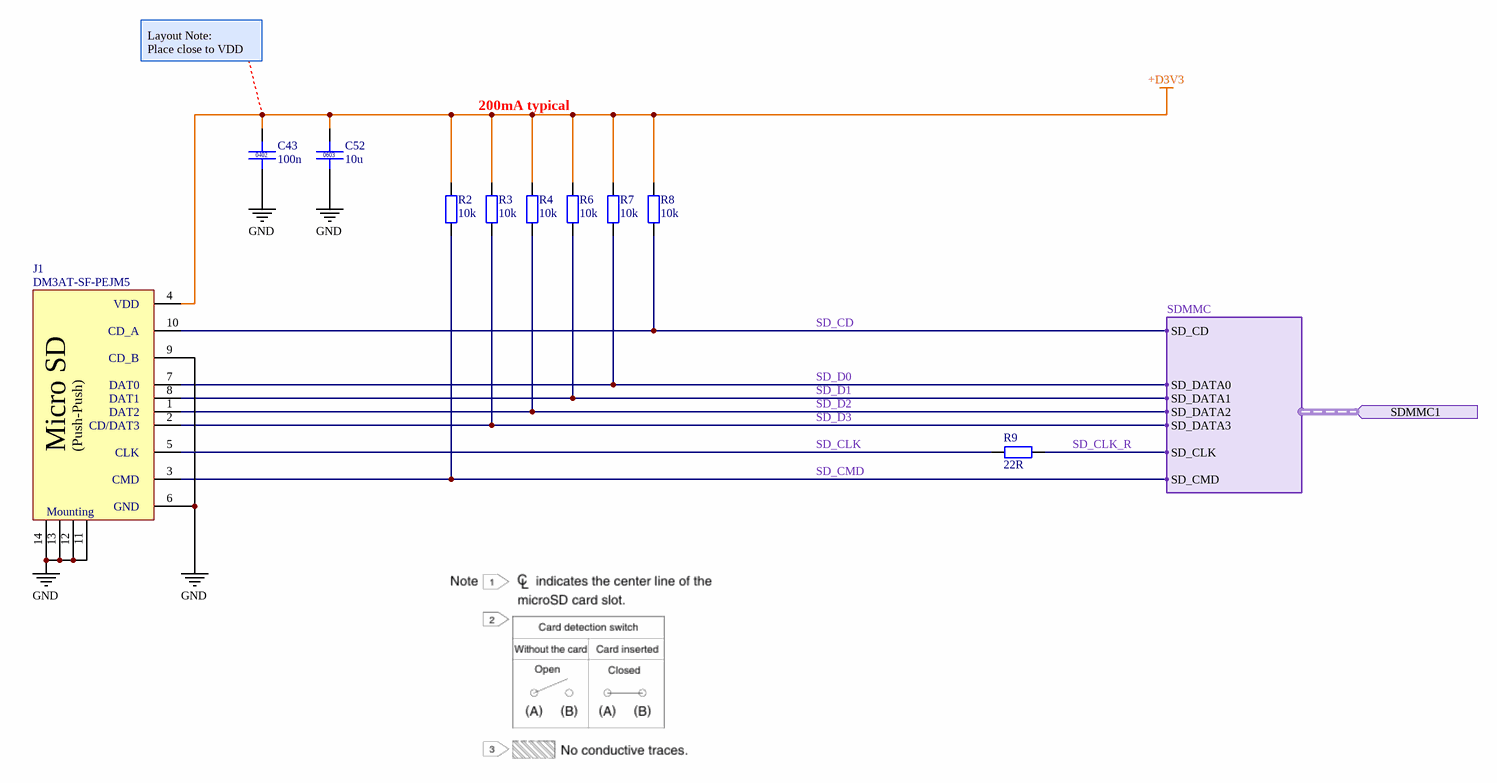
[diagram p4: Memory_microSD.SchDoc]

### Parts
C43  100n  [CAPC1005X05N]
C52  10u  [CAPC1608X08N]
J1  DM3AT-SF-PEJM5  [FP-DM3AT-SF-PEJM5-MFG]
R2  10k  [IPC C R0402 NO SILK]
R3  10k  [IPC C R0402 NO SILK]
R4  10k  [IPC C R0402 NO SILK]
R6  10k  [IPC C R0402 NO SILK]
R7  10k  [IPC C R0402 NO SILK]
R8  10k  [IPC C R0402 NO SILK]
R9  22R  [IPC C R0402 NO SILK]

### Ports
SDMMC1 (in, harness SDMMC, see 1[4B], 4[2D])

### Harnesses
SDMMC: SD_CD, SD_DATA0, SD_DATA1, SD_DATA2, SD_DATA3, SD_CLK, SD_CMD

### Nets
+D3V3: C43.1 C52.1 J1.4(VDD) R2.2 R3.2 R4.2 R6.2 R7.2 R8.2
GND: C43.2 C52.2 J1.6(VSS) J1.9(B) J1.11(MNT_1) J1.12(MNT_2) J1.13(MNT_3) J1.14(MNT_4)
SD_CD: J1.10(A) R8.1 ; port SDMMC1.SD_CD
SD_CLK: J1.5(CLK) R9.1
SD_CLK_R: R9.2 ; port SDMMC1.SD_CLK
SD_CMD: J1.3(CMD) R2.1 ; port SDMMC1.SD_CMD
SD_D0: J1.7(DAT0) R7.1 ; port SDMMC1.SD_DATA0
SD_D1: J1.8(DAT1) R6.1 ; port SDMMC1.SD_DATA1
SD_D2: J1.1(DAT2) R4.1 ; port SDMMC1.SD_DATA2
SD_D3: J1.2(CD/DAT3) R3.1 ; port SDMMC1.SD_DATA3

### Notes on the sheet
- Layout Note:
  Place close to VDD
- 200mA typical
- PROJECT
- KEY
- POWER
- 5 V class
- 3.3 V class
- Core / SMPS
- GND
- SHEET TITLE
- SIGNALS
- NOTES
- SPI
- Analog
- Design
- I2C
- PWM/Timer
- Layout
- UART/RC
- GPIO/Ctrl
- Assembly
- CAN
- Unused pin
- Firmware
- USB/SD/Clk
- Critical
- DRAWN
- DOCUMENT NO.
- CHECKED
- REV
- STATUS
- APPROVED
- DATE
- FILE
- SIZE
- A3
- SHEET
- of
- (in symbol CMP-031-000001-6) CD_A; CD_B; Micro SD; (Push-Push); GND; Mounting

### Library data of the parts
C43 = CMP-002-000094-5: as C2 on sheet MCU_Power; Value: 100n; Tolerance: 10%; Package: 0402; Voltage: 16V; Dielectric: X7R; LCSC Part #: C1525
C52 = CMP-002-000095-4: as C23 on sheet MCU_Power; Value: 10u; Tolerance: 10%; Package: 0603; Voltage: 10V; Dielectric: X5R; LCSC Part #: C19702
J1 = CMP-031-000001-6: PCB Connector, 8 Contact(s), 1 Row(s), Male, Right Angle, 0.043 inch Pitch, Surface Mount Terminal, Black Insulator, Receptacle
R2-R4 R6-R8 = CMP-008-000000-2: as R5 on sheet MCU_Power; Value: 10k; Source: Schlib1.SchLib; Design Item ID: Generic RES 0402; Package: 0402; Tolerance: 1%; Power: 1/16W; LCSC Part #: C25744
R9 = CMP-008-000000-2: RES 22R 1% 1/16W 0402; Manufacturer: UNI-ROYAL; Manufacturer Part Number: 0402WGF220JTCE; Value: 22R; Source: Schlib1.SchLib; Design Item ID: Generic RES 0402; Package: 0402; Tolerance: 1%; Power: 1/16W; LCSC Part #: C25092

## Sheet Sensor_DPS368.SchDoc: Sensors - Barometer 1 DPS368 (SPI1)
size A3; ApprovedBy: Weymen Koo; CheckedBy: -; DrawnBy: Weymen Koo; DocumentNumber: UBCAD-FCSOM-SCH; Revision: A; SheetNumber: 6; SheetTotal: 18; ProjectTitle: Flight Controller SoM; Status: PRELIMINARY; ReleaseDate: 2026-11-14
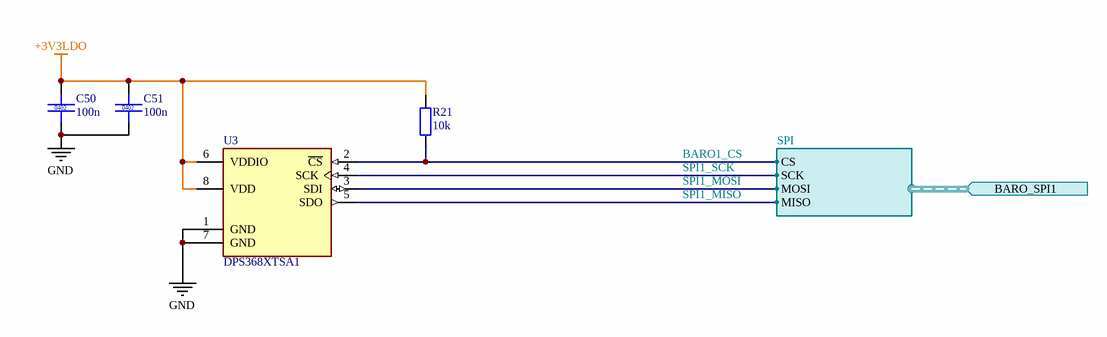
[diagram p5: Sensor_DPS368.SchDoc]

### Parts
C50  100n  [CAPC1005X05N]
C51  100n  [CAPC1005X05N]
R21  10k  [IPC C R0402 NO SILK]
U3  DPS368XTSA1  [FP-PG-VLGA-8-MFG]

### Ports
BARO_SPI1 (in, harness SPI, see 1[5B], 4[5D])

### Harnesses
SPI: CS, SCK, MOSI, MISO

### Nets
+3V3LDO: C50.1 C51.1 R21.2 U3.6(VDDIO) U3.8(VDD)
GND: C50.2 C51.2 U3.1(GND) U3.7(GND)
BARO1_CS: R21.1 U3.2(~{CS}) ; port BARO_SPI1.CS
SPI1_MISO: U3.5(SDO) ; port BARO_SPI1.MISO
SPI1_MOSI: U3.3(SDI) ; port BARO_SPI1.MOSI
SPI1_SCK: U3.4(SCK) ; port BARO_SPI1.SCK

### Notes on the sheet
- PROJECT
- KEY
- POWER
- 5 V class
- 3.3 V class
- Core / SMPS
- GND
- SHEET TITLE
- SIGNALS
- NOTES
- SPI
- Analog
- Design
- I2C
- PWM/Timer
- Layout
- UART/RC
- GPIO/Ctrl
- Assembly
- CAN
- Unused pin
- Firmware
- USB/SD/Clk
- Critical
- DRAWN
- DOCUMENT NO.
- CHECKED
- REV
- STATUS
- APPROVED
- DATE
- FILE
- SIZE
- A3
- SHEET
- of

### Library data of the parts
C50 C51 = CMP-002-000094-5: as C2 on sheet MCU_Power; Value: 100n; Tolerance: 10%; Package: 0402; Voltage: 16V; Dielectric: X7R; LCSC Part #: C1525
R21 = CMP-008-000000-2: as R5 on sheet MCU_Power; Value: 10k; Source: Schlib1.SchLib; Design Item ID: Generic RES 0402; Package: 0402; Tolerance: 1%; Power: 1/16W; LCSC Part #: C25744
U3 = CMP-292-000000-1: DIGITAL PRESSURE SENSOR; Manufacturer: Infineon; Sensor Output: I2C,SPI; Max Supply Voltage: 3.6V; Min Supply Voltage: 1.2V; Port Style: No Port; Operating Supply Current: 345uA; Device Class L2: Pressure Sensors; Device Class L1: Sensors; Source: CRLS Lib.SchLib; Temperature: -40°C to +85°C; Pin Count: 8; Lead Free: Yes; Temperature Range Low: -40°C; RoHS: TRUE; Manufacturer Part Number: DPS368XTSA1; Temperature Range High: 85°C; Ambient Temperature Range High: +85°C; Octopart: https://octopart.com/dps368xtsa1-infineon-98278029; Device Class L3: unset; Ambient Temperature Range Low: -40°C; Height: 1.1mm; Automotive: No; Package: PG-VLGA-8; Component Type: Standard; Category: IC; Digikey Description: DIGITAL PRESSURE SENSOR; Design Item ID: BARO_DPS368XTSA1; Footprint Url: https://www.infineon.com/cms/en/product/packages/PG-VLGA/PG-VLGA-8-2/

## Sheet Sensor_LSM6DSV32X.SchDoc: Sensors - IMU 1 LSM6DSV32X (SPI1)
size A3; ApprovedBy: Weymen Koo; CheckedBy: -; DrawnBy: Weymen Koo; DocumentNumber: UBCAD-FCSOM-SCH; Revision: A; SheetNumber: 5; SheetTotal: 18; ProjectTitle: Flight Controller SoM; Status: PRELIMINARY; ReleaseDate: 2026-11-14
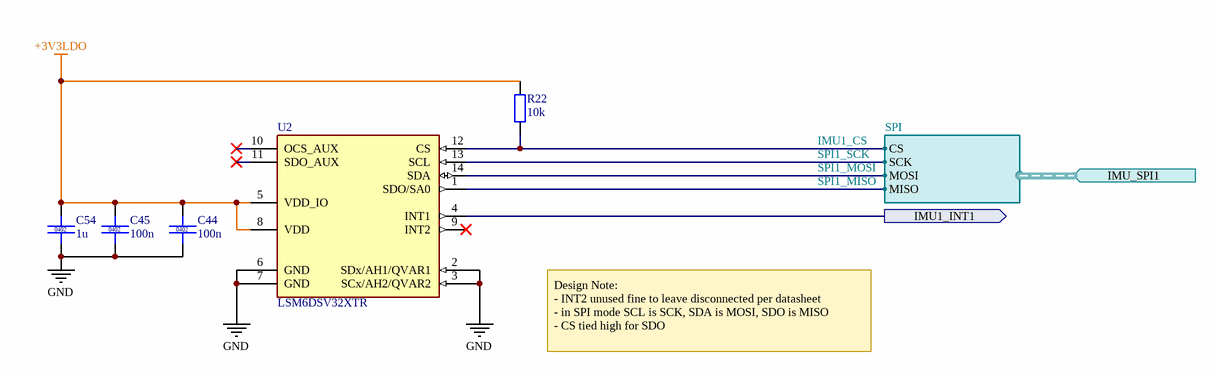
[diagram p6: Sensor_LSM6DSV32X.SchDoc]

### Parts
C44  100n  [CAPC1005X05N]
C45  100n  [CAPC1005X05N]
C54  1u  [CAPC1005X05N]
R22  10k  [IPC C R0402 NO SILK]
U2  LSM6DSV32XTR  [LGA-14L_L3.0-W2.5-P0.50-TL]

### Ports
IMU1_INT1 (out, see 1[5A], 4[9B]), IMU_SPI1 (in, harness SPI, see 1[5A], 4[9B])

### Harnesses
SPI: CS, SCK, MOSI, MISO

### Nets
+3V3LDO: C44.1 C45.1 C54.1 R22.2 U2.5(VDD_IO) U2.8(VDD)
GND: C44.2 C45.2 C54.2 U2.2(SDx/AH1/QVAR1) U2.3(SCx/AH2/QVAR2) U2.6(GND) U2.7(GND)
IMU1_CS: R22.1 U2.12(CS) ; port IMU_SPI1.CS
IMU1_INT1: U2.4(INT1) ; port IMU1_INT1
SPI1_MISO: U2.1(SDO/SA0) ; port IMU_SPI1.MISO
SPI1_MOSI: U2.14(SDA) ; port IMU_SPI1.MOSI
SPI1_SCK: U2.13(SCL) ; port IMU_SPI1.SCK

Not connected (* = marked no-connect by the designer): U2 9(INT2)* 10(OCS_AUX)* 11(SDO_AUX)*

### Notes on the sheet
- Design Note:
  - INT2 unused fine to leave disconnected per datasheet
  - in SPI mode SCL is SCK, SDA is MOSI, SDO is MISO
  - CS tied high for SDO
- PROJECT
- KEY
- POWER
- 5 V class
- 3.3 V class
- Core / SMPS
- GND
- SHEET TITLE
- SIGNALS
- NOTES
- SPI
- Analog
- Design
- I2C
- PWM/Timer
- Layout
- UART/RC
- GPIO/Ctrl
- Assembly
- CAN
- Unused pin
- Firmware
- USB/SD/Clk
- Critical
- DRAWN
- DOCUMENT NO.
- CHECKED
- REV
- STATUS
- APPROVED
- DATE
- FILE
- SIZE
- A3
- SHEET
- of

### Library data of the parts
C44 C45 = CMP-002-000094-5: as C2 on sheet MCU_Power; Value: 100n; Tolerance: 10%; Package: 0402; Voltage: 16V; Dielectric: X7R; LCSC Part #: C1525
C54 = CMP-002-000094-5: as C24 on sheet MCU_Power; Value: 1u; Tolerance: 10%; Package: 0402; Voltage: 25V; Dielectric: X5R; LCSC Part #: C52923
R22 = CMP-008-000000-2: as R5 on sheet MCU_Power; Value: 10k; Source: Schlib1.SchLib; Design Item ID: Generic RES 0402; Package: 0402; Tolerance: 1%; Power: 1/16W; LCSC Part #: C25744
U2 = CMP-292-000005-1: IMU, 6-axis, +/-32 g, +/-4000 dps, SPI/I2C, LGA-14; Design Item ID: IMU_LSM6DSV32X; Source: CRLS Lib.SchLib; Component Type: Standard; Pin Count: 14

## Sheet Sensor_LIS2MDL.SchDoc: Sensors - Magnetometer LIS2MDL (I2C4)
size A3; ApprovedBy: Weymen Koo; CheckedBy: -; DrawnBy: Weymen Koo; DocumentNumber: UBCAD-FCSOM-SCH; Revision: A; SheetNumber: 9; SheetTotal: 18; ProjectTitle: Flight Controller SoM; Status: PRELIMINARY; ReleaseDate: 2026-11-14
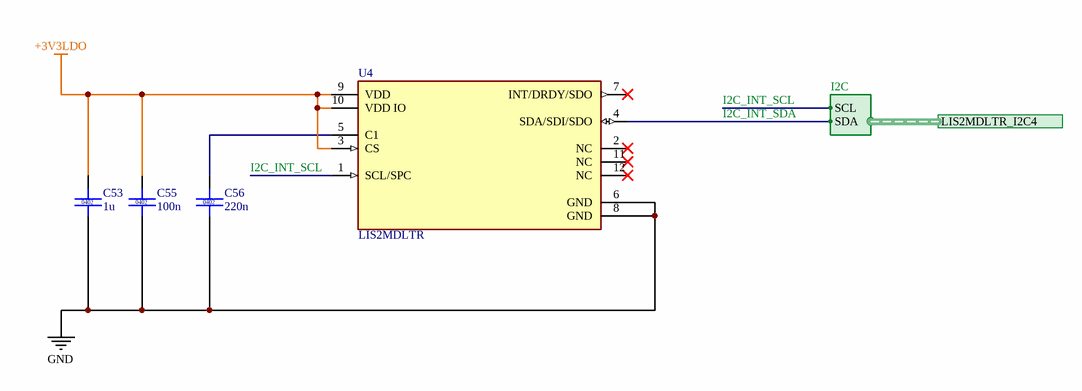
[diagram p7: Sensor_LIS2MDL.SchDoc]

### Parts
C53  1u  [CAPC1005X05N]
C55  100n  [CAPC1005X05N]
C56  220n  [CAPC1005X05N]
U4  LIS2MDLTR  [FP-LGA-12-DM00170568-MFG]

### Ports
LIS2MDLTR_I2C4 (harness I2C, see 1[5B], 4[0@])

### Harnesses
I2C: SDA, SCL

### Nets
+3V3LDO: C53.1 C55.1 U4.3(CS) U4.9(VDD) U4.10(VDD_IO)
GND: C53.2 C55.2 C56.2 U4.6(GND) U4.8(GND)
I2C_INT_SCL: U4.1(SCL/SPC) ; port LIS2MDLTR_I2C4.SCL
I2C_INT_SDA: U4.4(SDA/SDI/SDO) ; port LIS2MDLTR_I2C4.SDA
NetC56_1: C56.1 U4.5(C1)

Not connected (* = marked no-connect by the designer): U4 2(NC)* 7(INT/DRDY/SDO)* 11(NC)* 12(NC)*

### Notes on the sheet
- PROJECT
- KEY
- POWER
- 5 V class
- 3.3 V class
- Core / SMPS
- GND
- SHEET TITLE
- SIGNALS
- NOTES
- SPI
- Analog
- Design
- I2C
- PWM/Timer
- Layout
- UART/RC
- GPIO/Ctrl
- Assembly
- CAN
- Unused pin
- Firmware
- USB/SD/Clk
- Critical
- DRAWN
- DOCUMENT NO.
- CHECKED
- REV
- STATUS
- APPROVED
- DATE
- FILE
- SIZE
- A3
- SHEET
- of

### Library data of the parts
C53 = CMP-002-000094-5: as C24 on sheet MCU_Power; Value: 1u; Tolerance: 10%; Package: 0402; Voltage: 25V; Dielectric: X5R; LCSC Part #: C52923
C55 = CMP-002-000094-5: as C2 on sheet MCU_Power; Value: 100n; Tolerance: 10%; Package: 0402; Voltage: 16V; Dielectric: X7R; LCSC Part #: C1525
C56 = CMP-002-000094-5: CAP 220n 16V X7R 10% 0402; Manufacturer: Samsung; Manufacturer Part Number: CL05B224KO5NNNC; Value: 220n; Tolerance: 10%; Package: 0402; Voltage: 16V; Dielectric: X7R; LCSC Part #: C16772
U4 = CMP-12173-000002-1: SENSOR MR I2C/SPI 12LGA; Manufacturer: STMicroelectronics; Sensing Method: Magnetic; Min Supply Voltage: 1.71V; Sensor Output: I2C,SPI; Operating Supply Current: 50-200uA; Max Supply Voltage: 3.6V; Octopart: https://octopart.com/lis2mdltr-stmicroelectronics-81117311; RoHS: TRUE; Device Class L3: unset; Device Class L1: Sensors; ComponentLink2URL: https://www.st.com/resource/en/datasheet/lis2mdl.pdf; Automotive: No; Device Class L2: Magnetic Sensors; Lead Free: Yes; Temperature: -40°C to +85°C; Manufacturer Part Number: LIS2MDLTR; Temperature Range High: +85°C; Height: 0.7mm; Digikey Description: SENSOR MR I2C/SPI 12LGA; Category: IC; ComponentLink2Description: Datasheet; Package: LGA-12-DM00170568; Temperature Range Low: -40°C

## Sheet Sensor2_MS5611.SchDoc: Sensors - Barometer 2 MS5611 (SPI5)
size A3; ApprovedBy: Weymen Koo; CheckedBy: -; DrawnBy: Weymen Koo; DocumentNumber: UBCAD-FCSOM-SCH; Revision: A; SheetNumber: 8; SheetTotal: 18; ProjectTitle: Flight Controller SoM; Status: PRELIMINARY; ReleaseDate: 2026-11-14
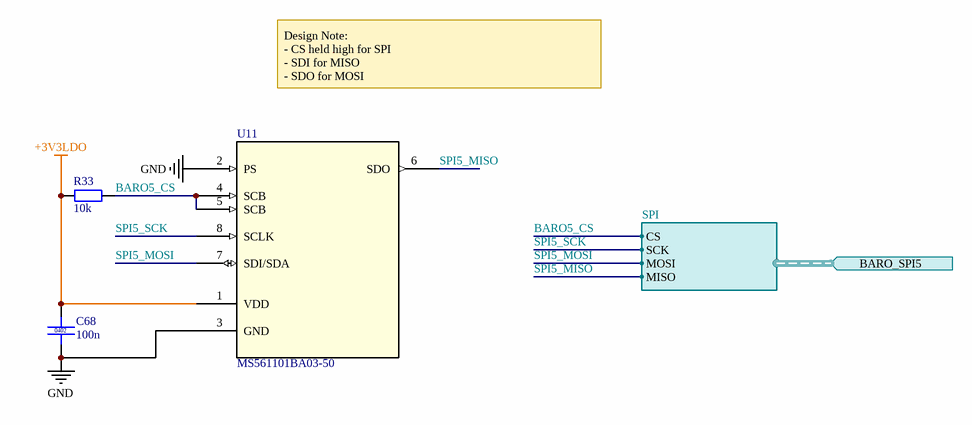
[diagram p8: Sensor2_MS5611.SchDoc]

### Parts
C68  100n  [CAPC1005X05N]
R33  10k  [IPC C R0402 NO SILK]
U11  MS561101BA03-50  [SON8_MS5611_TEC]

### Ports
BARO_SPI5 (in, harness SPI, see 1[5B], 4[5C])

### Harnesses
SPI: CS, SCK, MOSI, MISO

### Nets
+3V3LDO: C68.1 R33.1 U11.1(VDD)
GND: C68.2 U11.2(PS) U11.3(GND)
BARO5_CS: R33.2 U11.4(SCB) U11.5(SCB) ; port BARO_SPI5.CS  [project net BARO2_CS]
SPI5_MISO: U11.6(SDO) ; port BARO_SPI5.MISO
SPI5_MOSI: U11.7(SDI/SDA) ; port BARO_SPI5.MOSI
SPI5_SCK: U11.8(SCLK) ; port BARO_SPI5.SCK

### Notes on the sheet
- Design Note:
  - CS held high for SPI
  - SDI for MISO
  - SDO for MOSI
  - SCLK for SCK
- PROJECT
- KEY
- POWER
- 5 V class
- 3.3 V class
- Core / SMPS
- GND
- SHEET TITLE
- SIGNALS
- NOTES
- SPI
- Analog
- Design
- I2C
- PWM/Timer
- Layout
- UART/RC
- GPIO/Ctrl
- Assembly
- CAN
- Unused pin
- Firmware
- USB/SD/Clk
- Critical
- DRAWN
- DOCUMENT NO.
- CHECKED
- REV
- STATUS
- APPROVED
- DATE
- FILE
- SIZE
- A3
- SHEET
- of

### Library data of the parts
C68 = CMP-002-000094-5: as C2 on sheet MCU_Power; Value: 100n; Tolerance: 10%; Package: 0402; Voltage: 16V; Dielectric: X7R; LCSC Part #: C1525
R33 = CMP-008-000000-2: as R5 on sheet MCU_Power; Value: 10k; Source: Schlib1.SchLib; Design Item ID: Generic RES 0402; Package: 0402; Tolerance: 1%; Power: 1/16W; LCSC Part #: C25744
U11 = CMP-325-000000-2: MS5611 BAROMETRIC SENSOR CM T&R; Manufacturer_Name: TE Connectivity; Copyright: Copyright (C) 2026 Ultra Librarian. All rights reserved.; Design Item ID: MS561101BA03-50; RefDes: RefDes; Type: Type; Source: MS561101BA03-50.SchLib; Manufacturer_Part_Number: MS561101BA03-50

## Sheet Sensor2_ICM-42688-P.SchDoc: Sensors - IMU 2 ICM-42688-P (SPI5)
size A3; ApprovedBy: Weymen Koo; CheckedBy: -; DrawnBy: Weymen Koo; DocumentNumber: UBCAD-FCSOM-SCH; Revision: A; SheetNumber: 7; SheetTotal: 18; ProjectTitle: Flight Controller SoM; Status: PRELIMINARY; ReleaseDate: 2026-11-14
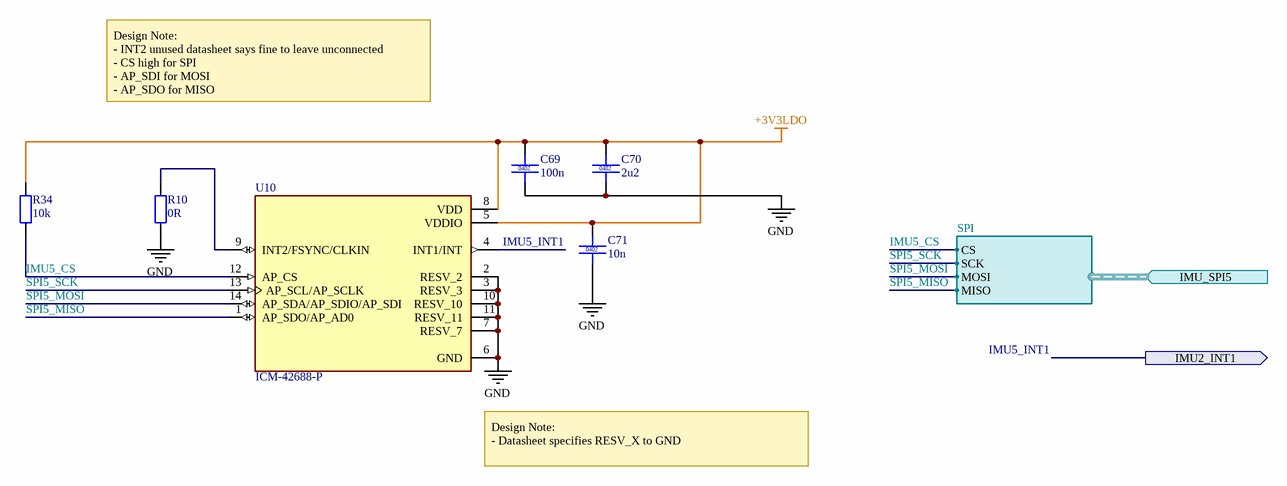
[diagram p9: Sensor2_ICM-42688-P.SchDoc]

### Parts
C69  100n  [CAPC1005X05N]
C70  2u2  [CAPC1005X05N]
C71  10n  [CAPC1005X05N]
R10  0R  [IPC C R0402 NO SILK]
R34  10k  [IPC C R0402 NO SILK]
U10  ICM-42688-P  [PQFN50P300X250X97-14N]

### Ports
IMU2_INT1 (out, see 1[5B], 4[9B]), IMU_SPI5 (in, harness SPI, see 1[5B], 4[9C])

### Harnesses
SPI: CS, SCK, MOSI, MISO

### Nets
+3V3LDO: C69.1 C70.1 C71.1 R34.2 U10.5(VDDIO) U10.8(VDD)
GND: C69.2 C70.2 C71.2 R10.1 U10.2(RESV_2) U10.3(RESV_3) U10.6(GND) U10.7(RESV_7) U10.10(RESV_10) U10.11(RESV_11)
IMU5_CS: R34.1 U10.12(AP_CS) ; port IMU_SPI5.CS  [project net IMU2_CS]
IMU5_INT1: U10.4(INT1/INT) ; port IMU2_INT1  [project net IMU2_INT1]
SPI5_MISO: U10.1(AP_SDO/AP_AD0) ; port IMU_SPI5.MISO
SPI5_MOSI: U10.14(AP_SDA/AP_SDIO/AP_SDI) ; port IMU_SPI5.MOSI
SPI5_SCK: U10.13(AP_SCL/AP_SCLK) ; port IMU_SPI5.SCK
NetR10_2: R10.2 U10.9(INT2/FSYNC/CLKIN)

### Notes on the sheet
- Design Note:
  - INT2 unused datasheet says fine to leave unconnected
  - CS high for SPI
  - AP_SDI for MOSI
  - AP_SDO for MISO
- Design Note:
  - Datasheet specifies RESV_X to GND
- PROJECT
- KEY
- POWER
- 5 V class
- 3.3 V class
- Core / SMPS
- GND
- SHEET TITLE
- SIGNALS
- NOTES
- SPI
- Analog
- Design
- I2C
- PWM/Timer
- Layout
- UART/RC
- GPIO/Ctrl
- Assembly
- CAN
- Unused pin
- Firmware
- USB/SD/Clk
- Critical
- DRAWN
- DOCUMENT NO.
- CHECKED
- REV
- STATUS
- APPROVED
- DATE
- FILE
- SIZE
- A3
- SHEET
- of

### Library data of the parts
C69 = CMP-002-000094-5: as C2 on sheet MCU_Power; Value: 100n; Tolerance: 10%; Package: 0402; Voltage: 16V; Dielectric: X7R; LCSC Part #: C1525
C70 = CMP-002-000094-5: as C29 on sheet MCU_Power; Value: 2u2; Tolerance: 20%; Package: 0402; Voltage: 6.3V; Dielectric: X5R; LCSC Part #: C12530
C71 = CMP-002-000094-5: CAP 10n 50V X7R 10% 0402; Manufacturer: Samsung; Manufacturer Part Number: CL05B103KB5NNNC; Value: 10n; Tolerance: 10%; Package: 0402; Voltage: 50V; Dielectric: X7R; LCSC Part #: C15195
R10 = CMP-008-000000-2: RES 0R 1% 1/16W 0402; Manufacturer: UNI-ROYAL; Manufacturer Part Number: 0402WGF0000TCE; Value: 0R; Source: Schlib1.SchLib; Design Item ID: Generic RES 0402; Package: 0402; Tolerance: 1%; Power: 1/16W; LCSC Part #: C17168
R34 = CMP-008-000000-2: as R5 on sheet MCU_Power; Value: 10k; Source: Schlib1.SchLib; Design Item ID: Generic RES 0402; Package: 0402; Tolerance: 1%; Power: 1/16W; LCSC Part #: C25744
U10 = CMP-195-000000-1: Accelerometer, Gyroscope, 6 Axis Sensor Output; Value: *; Component Type: Standard; Price: None; MP: ICM-42688-P; Design Item ID: ICM-42688-P; Package: None; Availability: Unavailable; Pin Count: 14; Source: ICM-42688-P.SchLib

## Sheet Button_and_LEDs.SchDoc: User - Status LEDs
size A3; ApprovedBy: Weymen Koo; CheckedBy: -; DrawnBy: Weymen Koo; DocumentNumber: UBCAD-FCSOM-SCH; Revision: A; SheetNumber: 16; SheetTotal: 18; ProjectTitle: Flight Controller SoM; Status: PRELIMINARY; ReleaseDate: 2026-11-14
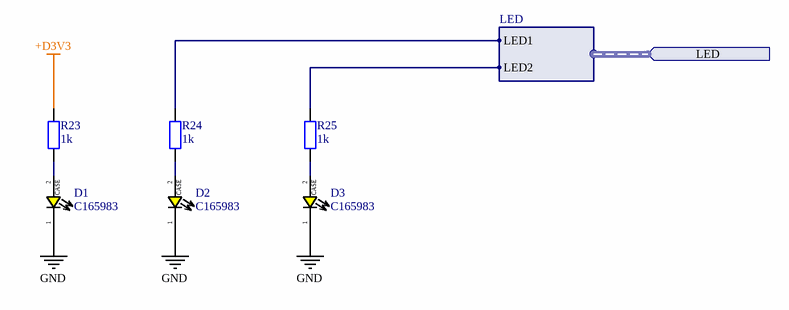
[diagram p10: Button_and_LEDs.SchDoc]

### Parts
D1  C165983  Package: CASE  [LED_0603_YELLOW]
D2  C165983  Package: CASE  [LED_0603_YELLOW]
D3  C165983  Package: CASE  [LED_0603_YELLOW]
R23  1k  [IPC C R0402 NO SILK]
R24  1k  [IPC C R0402 NO SILK]
R25  1k  [IPC C R0402 NO SILK]

### Ports
LED (in, harness LED, see 1[5D], 4[9D])

### Harnesses
LED: LED1, LED2

### Nets
+D3V3: R23.2
GND: D1.1 D2.1 D3.1
LED_G: R24.2 ; port LED.LED1
LED_R: R25.2 ; port LED.LED2
NetD1_2: D1.2 R23.1
NetD2_2: D2.2 R24.1
NetD3_2: D3.2 R25.1

### Notes on the sheet
- PROJECT
- KEY
- POWER
- 5 V class
- 3.3 V class
- Core / SMPS
- GND
- SHEET TITLE
- SIGNALS
- NOTES
- SPI
- Analog
- Design
- I2C
- PWM/Timer
- Layout
- UART/RC
- GPIO/Ctrl
- Assembly
- CAN
- Unused pin
- Firmware
- USB/SD/Clk
- Critical
- DRAWN
- DOCUMENT NO.
- CHECKED
- REV
- STATUS
- APPROVED
- DATE
- FILE
- SIZE
- A3
- SHEET
- of

### Library data of the parts
D1-D3 = CMP-006-000012-1: LED Yellow; Component Type: Standard; Design Item ID: LED_YELLOW; Color: Yellow; Source: CRLS Lib.SchLib; Pin Count: 2
R23-R25 = CMP-008-000000-2: RES 1k 1% 1/16W 0402; Manufacturer: UNI-ROYAL; Manufacturer Part Number: 0402WGF1001TCE; Value: 1k; Source: Schlib1.SchLib; Design Item ID: Generic RES 0402; Package: 0402; Tolerance: 1%; Power: 1/16W; LCSC Part #: C11702

## Sheet Interface_Debug.SchDoc: Interface - USB-C and SWD Debug
size A3; ApprovedBy: Weymen Koo; CheckedBy: -; DrawnBy: Weymen Koo; DocumentNumber: UBCAD-FCSOM-SCH; Revision: A; SheetNumber: 15; SheetTotal: 18; ProjectTitle: Flight Controller SoM; Status: PRELIMINARY; ReleaseDate: 2026-11-14
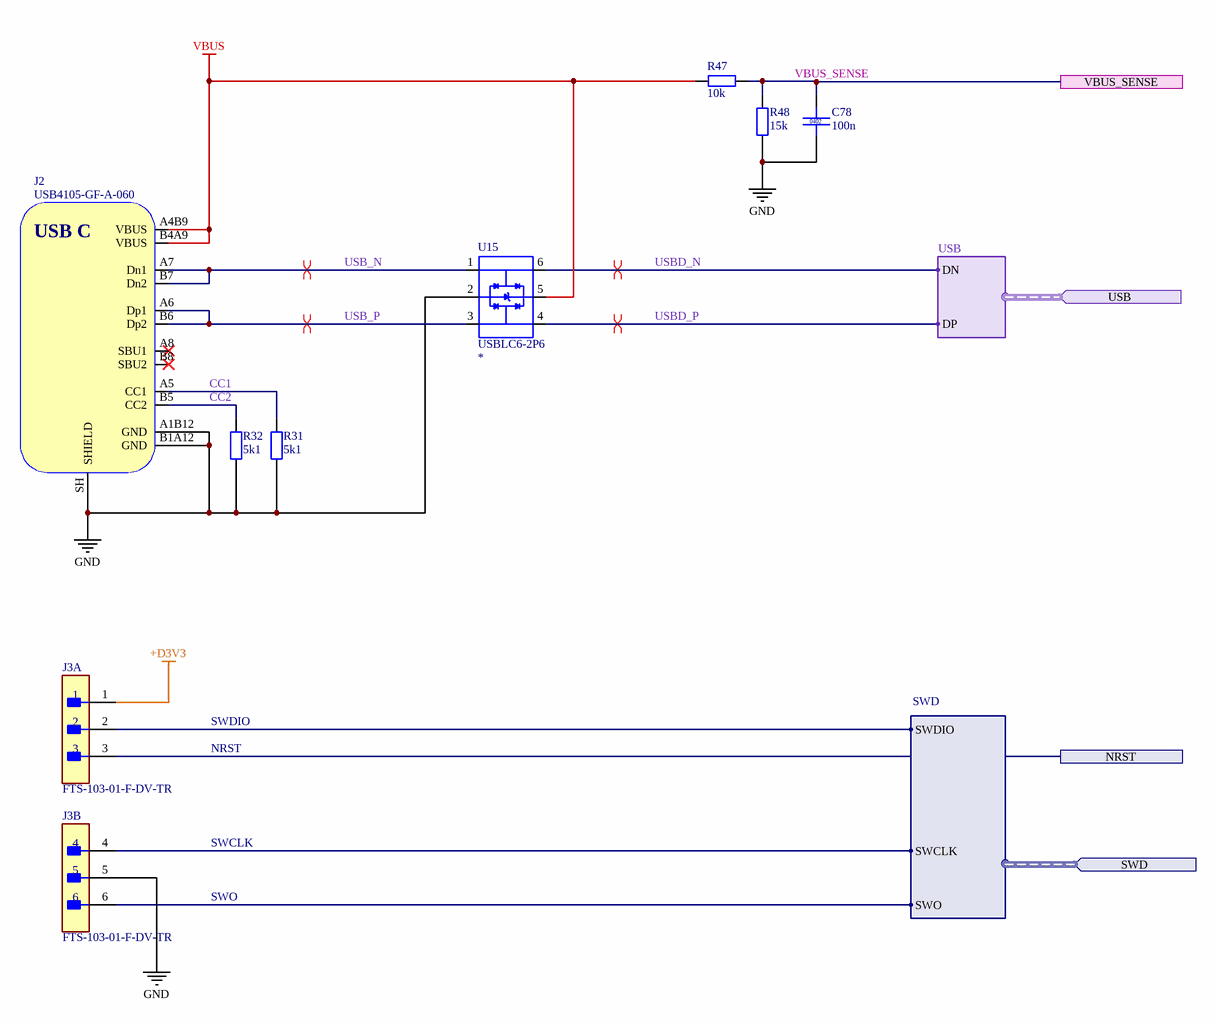
[diagram p11: Interface_Debug.SchDoc]

### Parts
C78  100n  [CAPC1005X05N]
J2  USB4105-GF-A-060  [USB4105-GF-A-060]
J3  FTS-103-01-F-DV-TR  [FP-FTS-103-01-F-DV-TR-MFG]  (parts A,B of 2)
R31  5k1  [IPC C R0402 NO SILK]
R32  5k1  [IPC C R0402 NO SILK]
R47  10k  [IPC C R0402 NO SILK]
R48  15k  [IPC C R0402 NO SILK]
U15  USBLC6-2P6  [SOT50P160X60-6N]

### Ports
NRST (see 1[4A], 3[7C], 17[5A]), SWD (in, harness SWD, see 1[4A], 4[9C]), USB (in, harness USB, see 1[4A], 4[9C]), VBUS_SENSE (see 1[3A], 4[9C])

### Harnesses
SWD: SWO, SWDIO, SWCLK
USB: DN, DP

### Nets
+D3V3: J3.1
GND: C78.2 J2.A1B12(GND) J2.B1A12(GND) J2.SH(SHIELD) J3.5 R31.2 R32.2 R48.2 U15.2(GND)
VBUS: J2.A4B9(VBUS) J2.B4A9(VBUS) R47.2 U15.5(VBUS)
CC1: J2.A5(CC1) R31.1
CC2: J2.B5(CC2) R32.1
NRST: J3.3 ; port NRST
SWCLK: J3.4 ; port SWD.SWCLK
SWDIO: J3.2 ; port SWD.SWDIO
SWO: J3.6 ; port SWD.SWO
USB_N: J2.A7(Dn1) J2.B7(Dn2) U15.1(I/O1_1)
USB_P: J2.A6(Dp1) J2.B6(Dp2) U15.3(I/O2_1)
USBD_N: U15.6(I/O1_2) ; port USB.DN
USBD_P: U15.4(I/O2_2) ; port USB.DP
VBUS_SENSE: C78.1 R47.1 R48.1 ; port VBUS_SENSE

Not connected (* = marked no-connect by the designer): J2 A8(SBU1)* B8(SBU2)*

### Layout directives
differential pair: USB_N, USB_P, USBD_N, USBD_P

### Notes on the sheet
- PROJECT
- KEY
- POWER
- 5 V class
- 3.3 V class
- Core / SMPS
- GND
- SHEET TITLE
- SIGNALS
- NOTES
- SPI
- Analog
- Design
- I2C
- PWM/Timer
- Layout
- UART/RC
- GPIO/Ctrl
- Assembly
- CAN
- Unused pin
- Firmware
- USB/SD/Clk
- Critical
- DRAWN
- DOCUMENT NO.
- CHECKED
- REV
- STATUS
- APPROVED
- DATE
- FILE
- SIZE
- A3
- SHEET
- of
- (in symbol CMP-164-000056-1) USB C

### Library data of the parts
C78 = CMP-002-000094-5: as C2 on sheet MCU_Power; Value: 100n; Tolerance: 10%; Package: 0402; Voltage: 16V; Dielectric: X7R; LCSC Part #: C1525
J2 = CMP-164-000056-1: USB Connector Type C SMT 12 Pin; Manufacturer: GCT; Distributor Link: https://eu.mouser.com/ProductDetail/GCT/USB4105-GF-A-060?qs=QNEnbhJQKvY2mocwNJzgfA%3D%3D; Manufacturer Part Number: USB4105-GF-A-060; Source: Schematic-Lib-PhilsLab.SchLib; Design Item ID: USB4105-GF-A-060
J3 = CMP-02761-000121-1: CONN HEADER SMD 6POS 1.27MM; Gender: Male; Number of Contacts: 6; Housing Material: Polymer; Radiation Hardening: No; Packaging: Tape and Reel; Termination: Solder; Min Operating Temperature: -55°C; Depth: 3.42mm; Length: 3.81mm; Orientation: Straight; Contact Plating: Gold; Contact Material: Bronze; RoHS Compliant: Yes; Housing Color: Black; REACH SVHC: No SVHC; Pitch: 1.27mm; Number of Rows: 2; Max Operating Temperature: 125°C
R31 R32 = CMP-008-000000-2: RES 5k1 1% 1/16W 0402; Manufacturer: UNI-ROYAL; Manufacturer Part Number: 0402WGF5101TCE; Value: 5k1; Source: Schlib1.SchLib; Design Item ID: Generic RES 0402; Package: 0402; Tolerance: 1%; Power: 1/16W; LCSC Part #: C25905
R47 = CMP-008-000000-2: as R5 on sheet MCU_Power; Value: 10k; Source: Schlib1.SchLib; Design Item ID: Generic RES 0402; Package: 0402; Tolerance: 1%; Power: 1/16W; LCSC Part #: C25744
R48 = CMP-008-000000-2: RES 15k 1% 1/16W 0402; Manufacturer: UNI-ROYAL; Manufacturer Part Number: 0402WGF1502TCE; Value: 15k; Source: Schlib1.SchLib; Design Item ID: Generic RES 0402; Package: 0402; Tolerance: 1%; Power: 1/16W; LCSC Part #: C25756
U15 = CMP-006-000005-3: ESD protection, 2 data lines and VBUS, SOT-666; MF: STMicroelectronics; MP: USBLC6-2P6; Source: SnapEDAsch.SchLib; Value: *; Availability: Unavailable; SnapEDA_Link: https://www.snapeda.com/parts/USBLC6-2P6/STMicroelectronics/view-part/106846/?ref=snap; Pin Count: 6; Design Item ID: USBLC6-2P6; Price: None; Package: SOT-563 STMicroelectronics; Component Type: Standard